# EasyEDA Pro project ProPrj_STM32_无人机_2026-08-31.epro, schematic 飞控

## Sheets
1 MCU: Assembly Variant: Basic; Board Name: Board1; Create Date: 2026-08-19; Page Name: P1; Project Name: STM32_无人机; Schematic Name: Schematic1; Update Date: 2026-08-19; Company: 嘉立创EDA; Page Size: A4; Version: V1.0
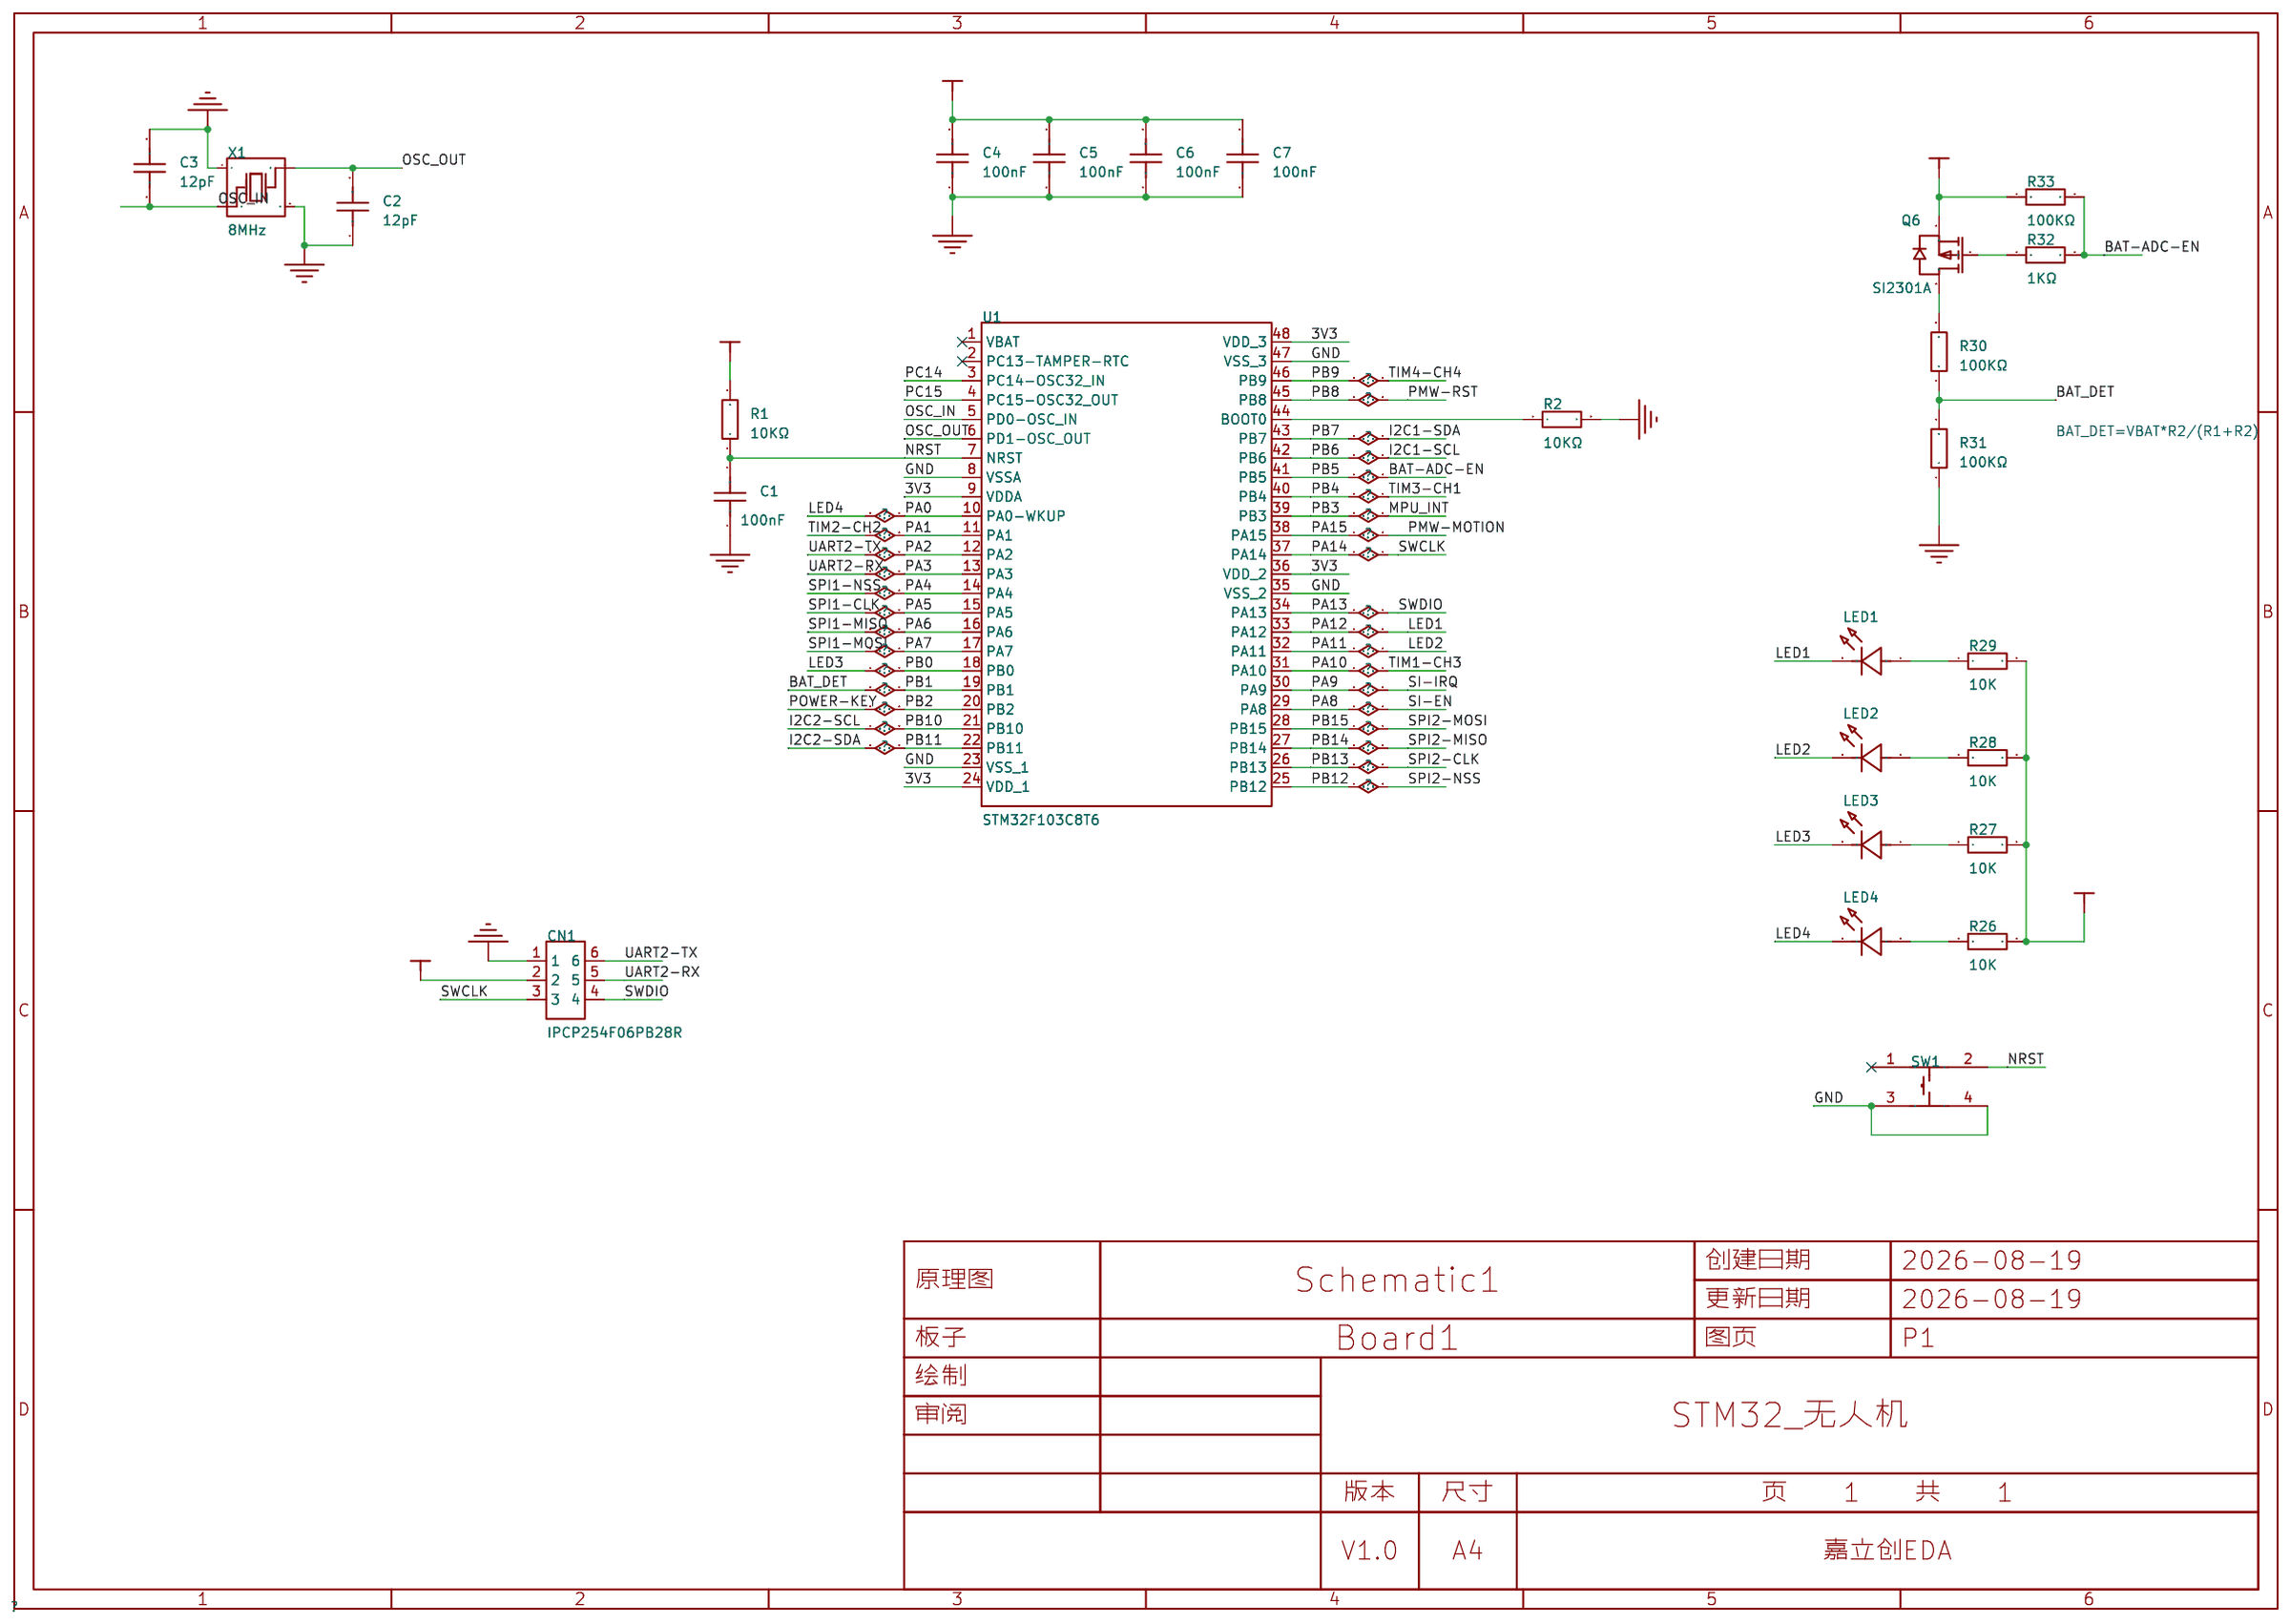
[diagram p5: MCU]
2 MPU6050
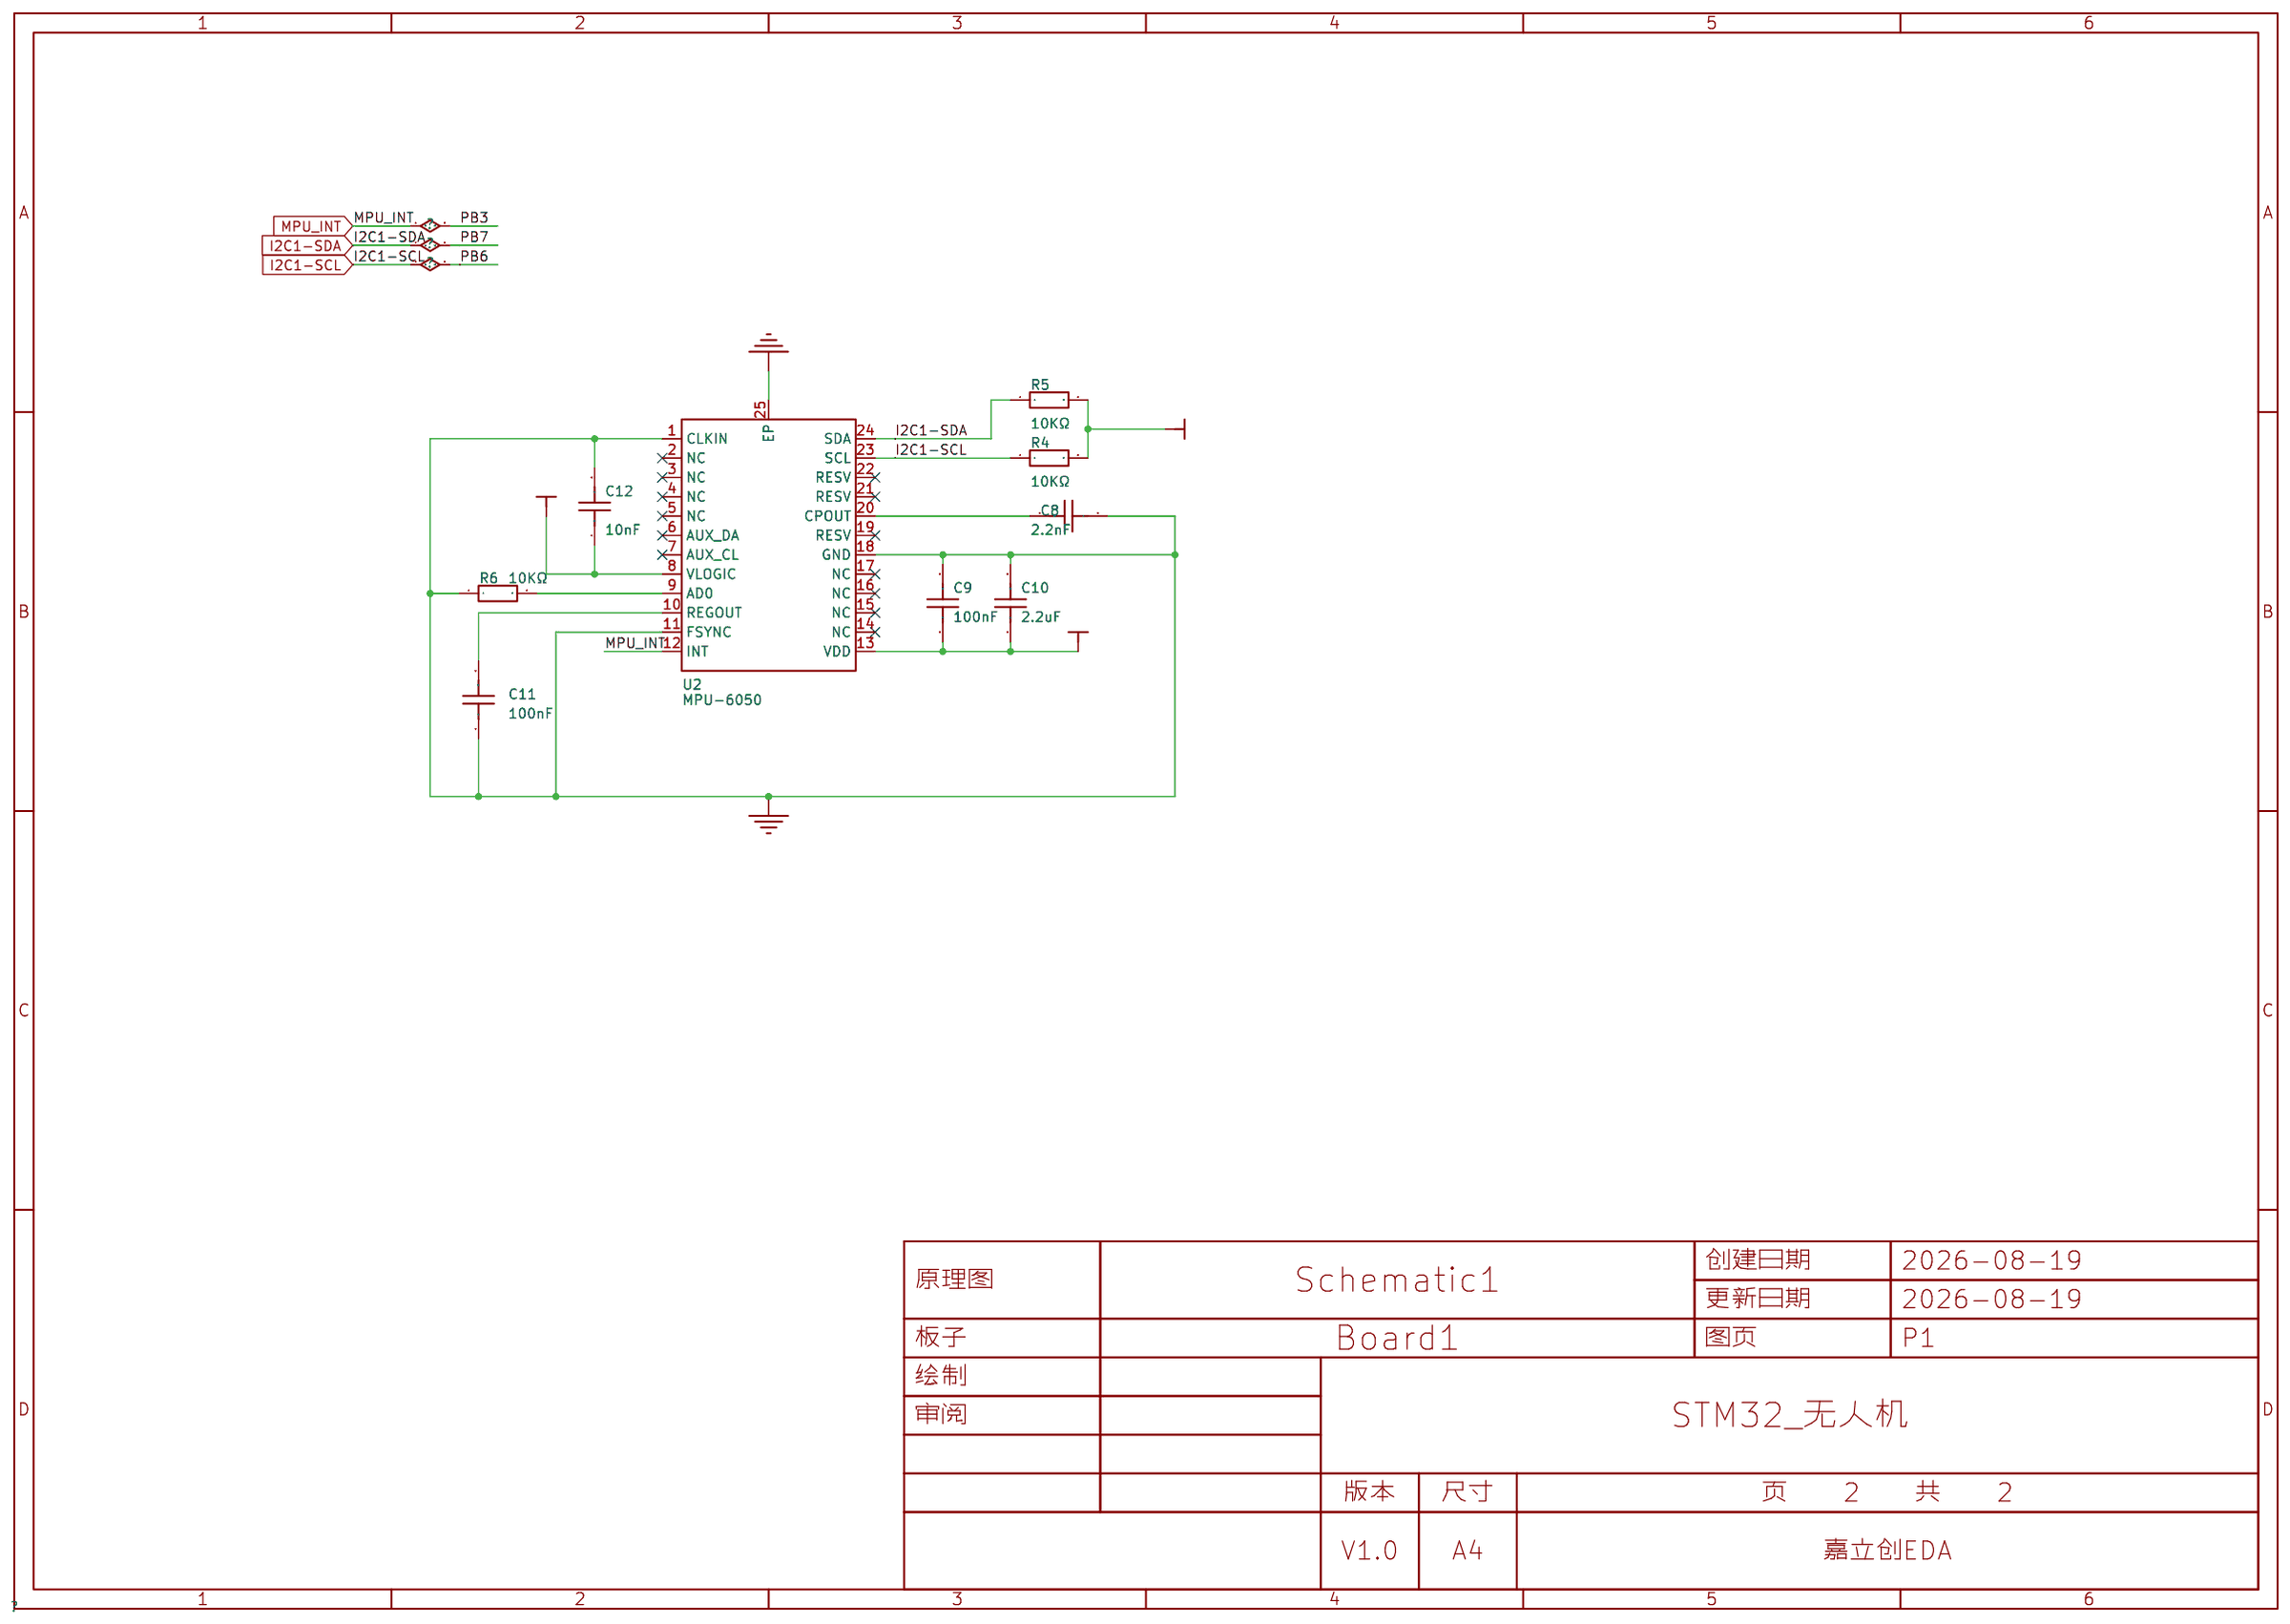
[diagram p6: MPU6050]
3 SI24R1
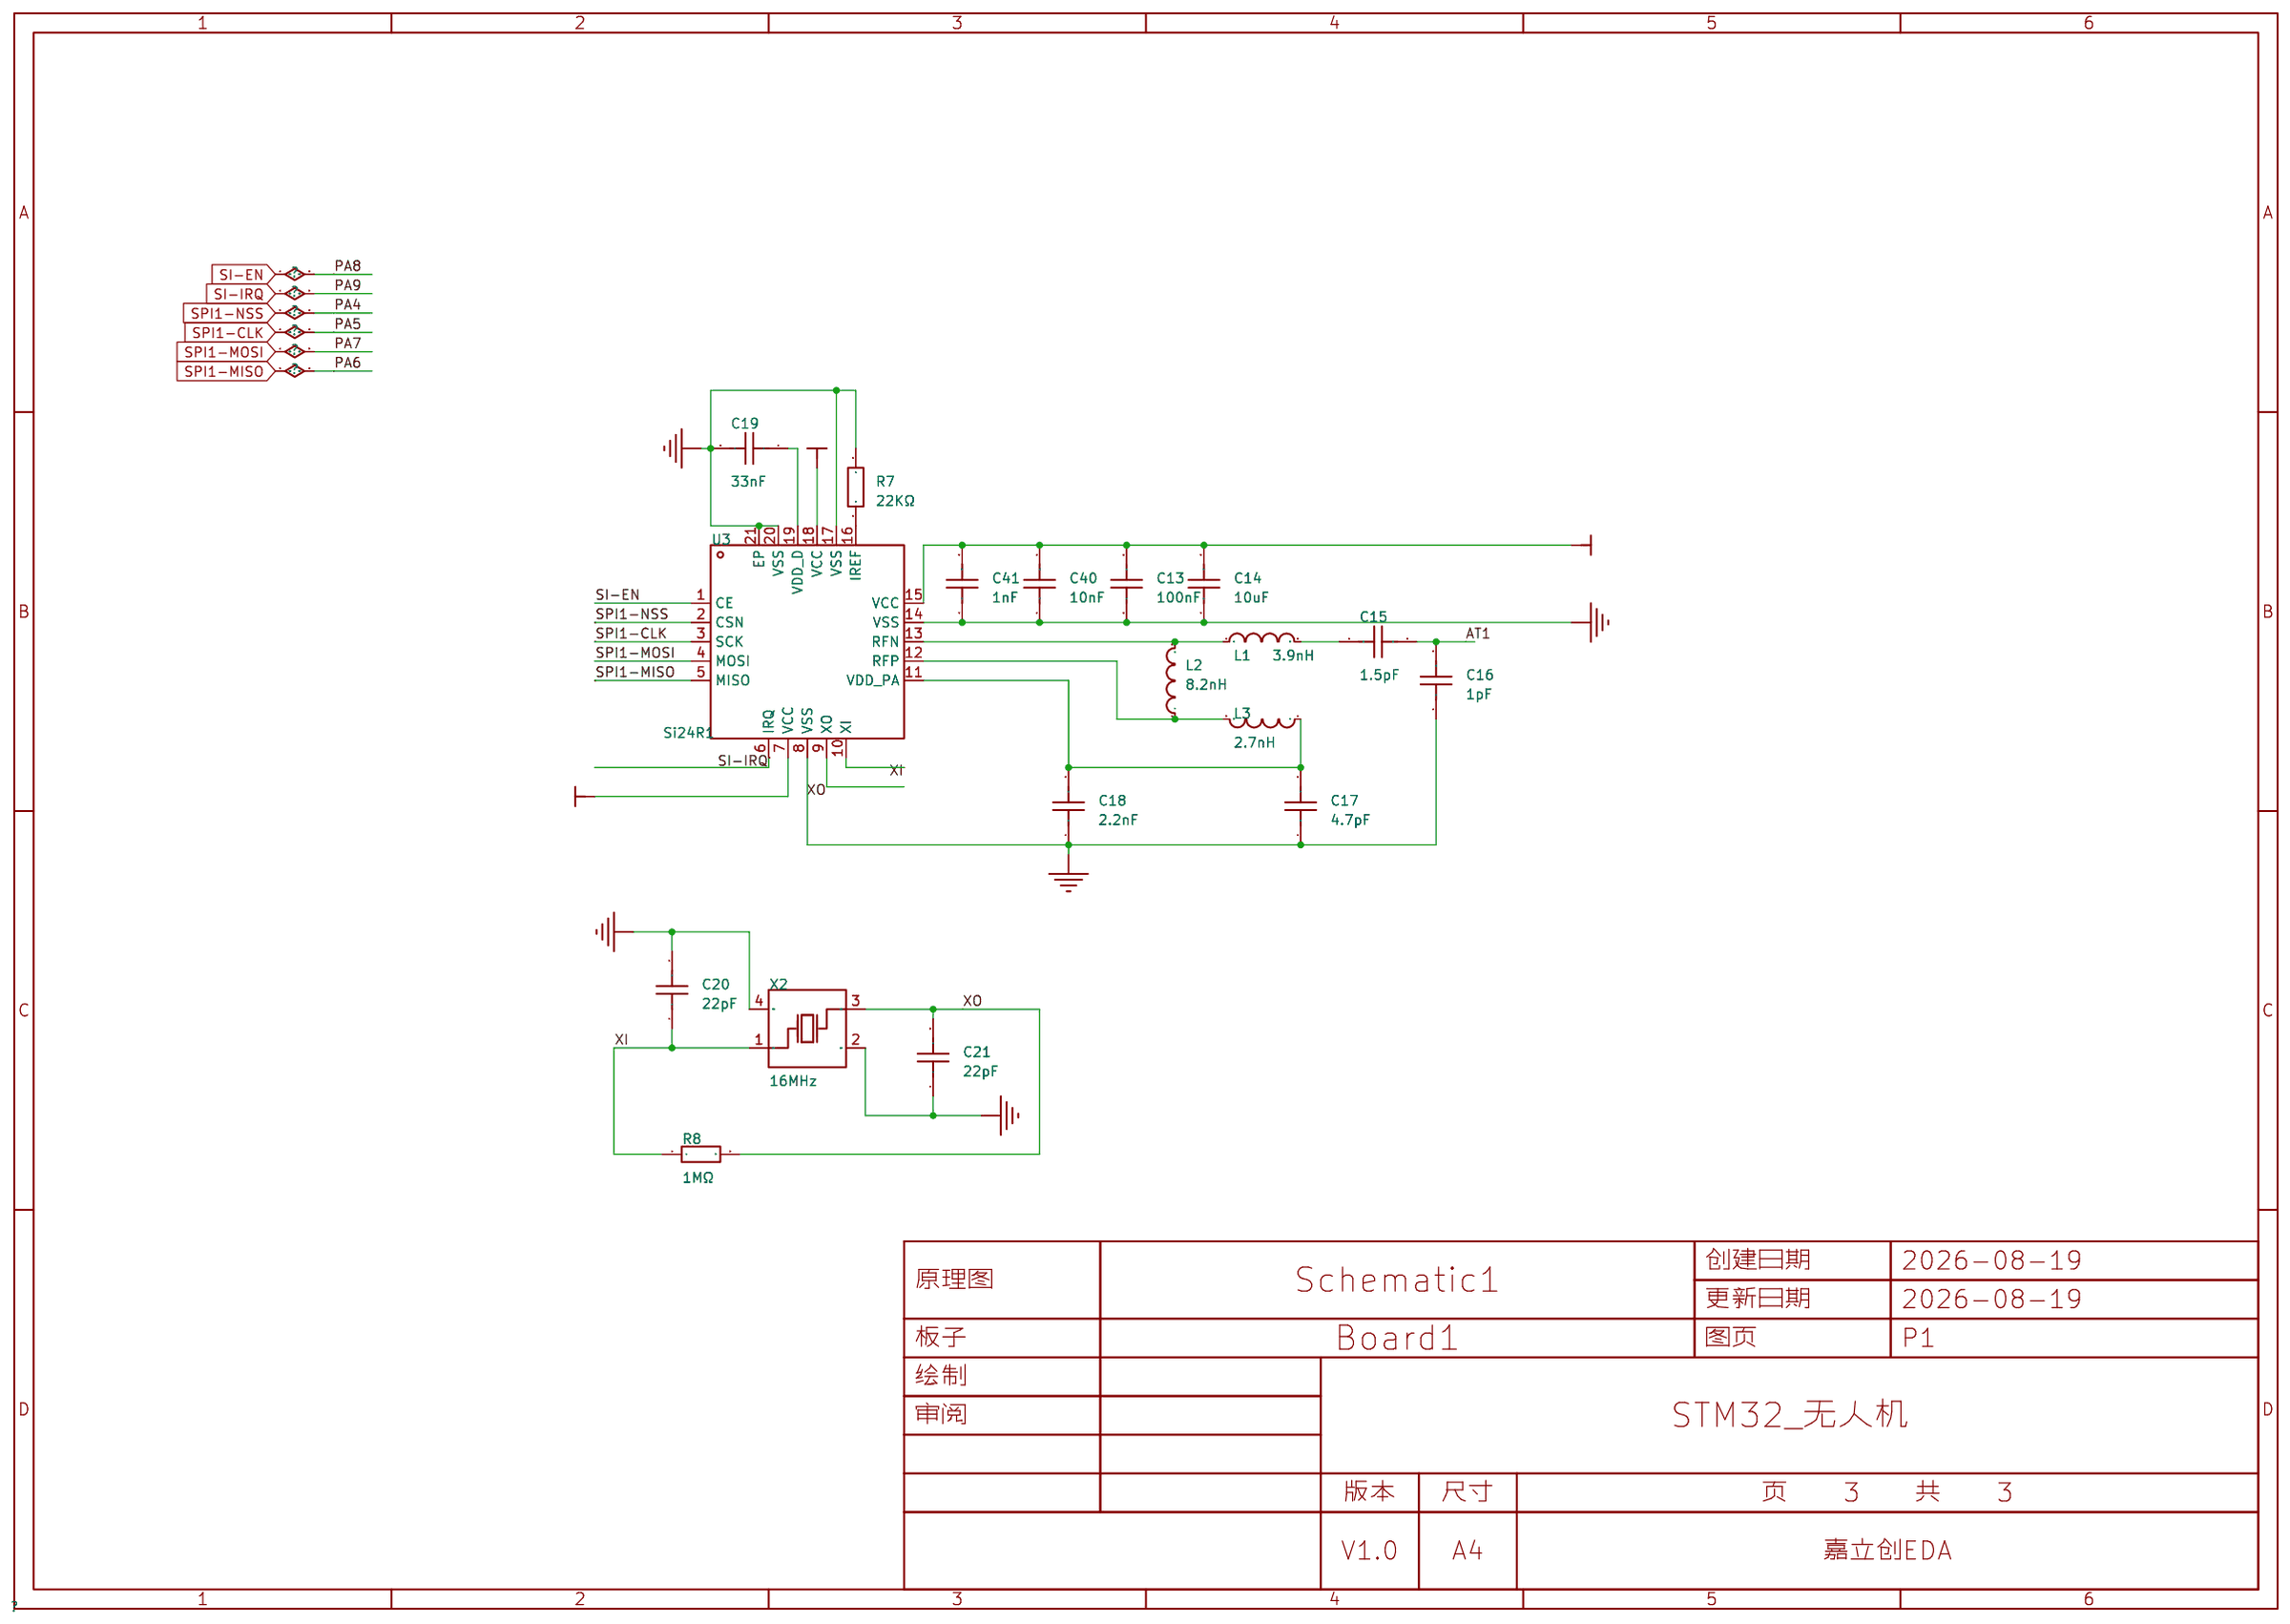
[diagram p7: SI24R1]
4 激光测高VL53
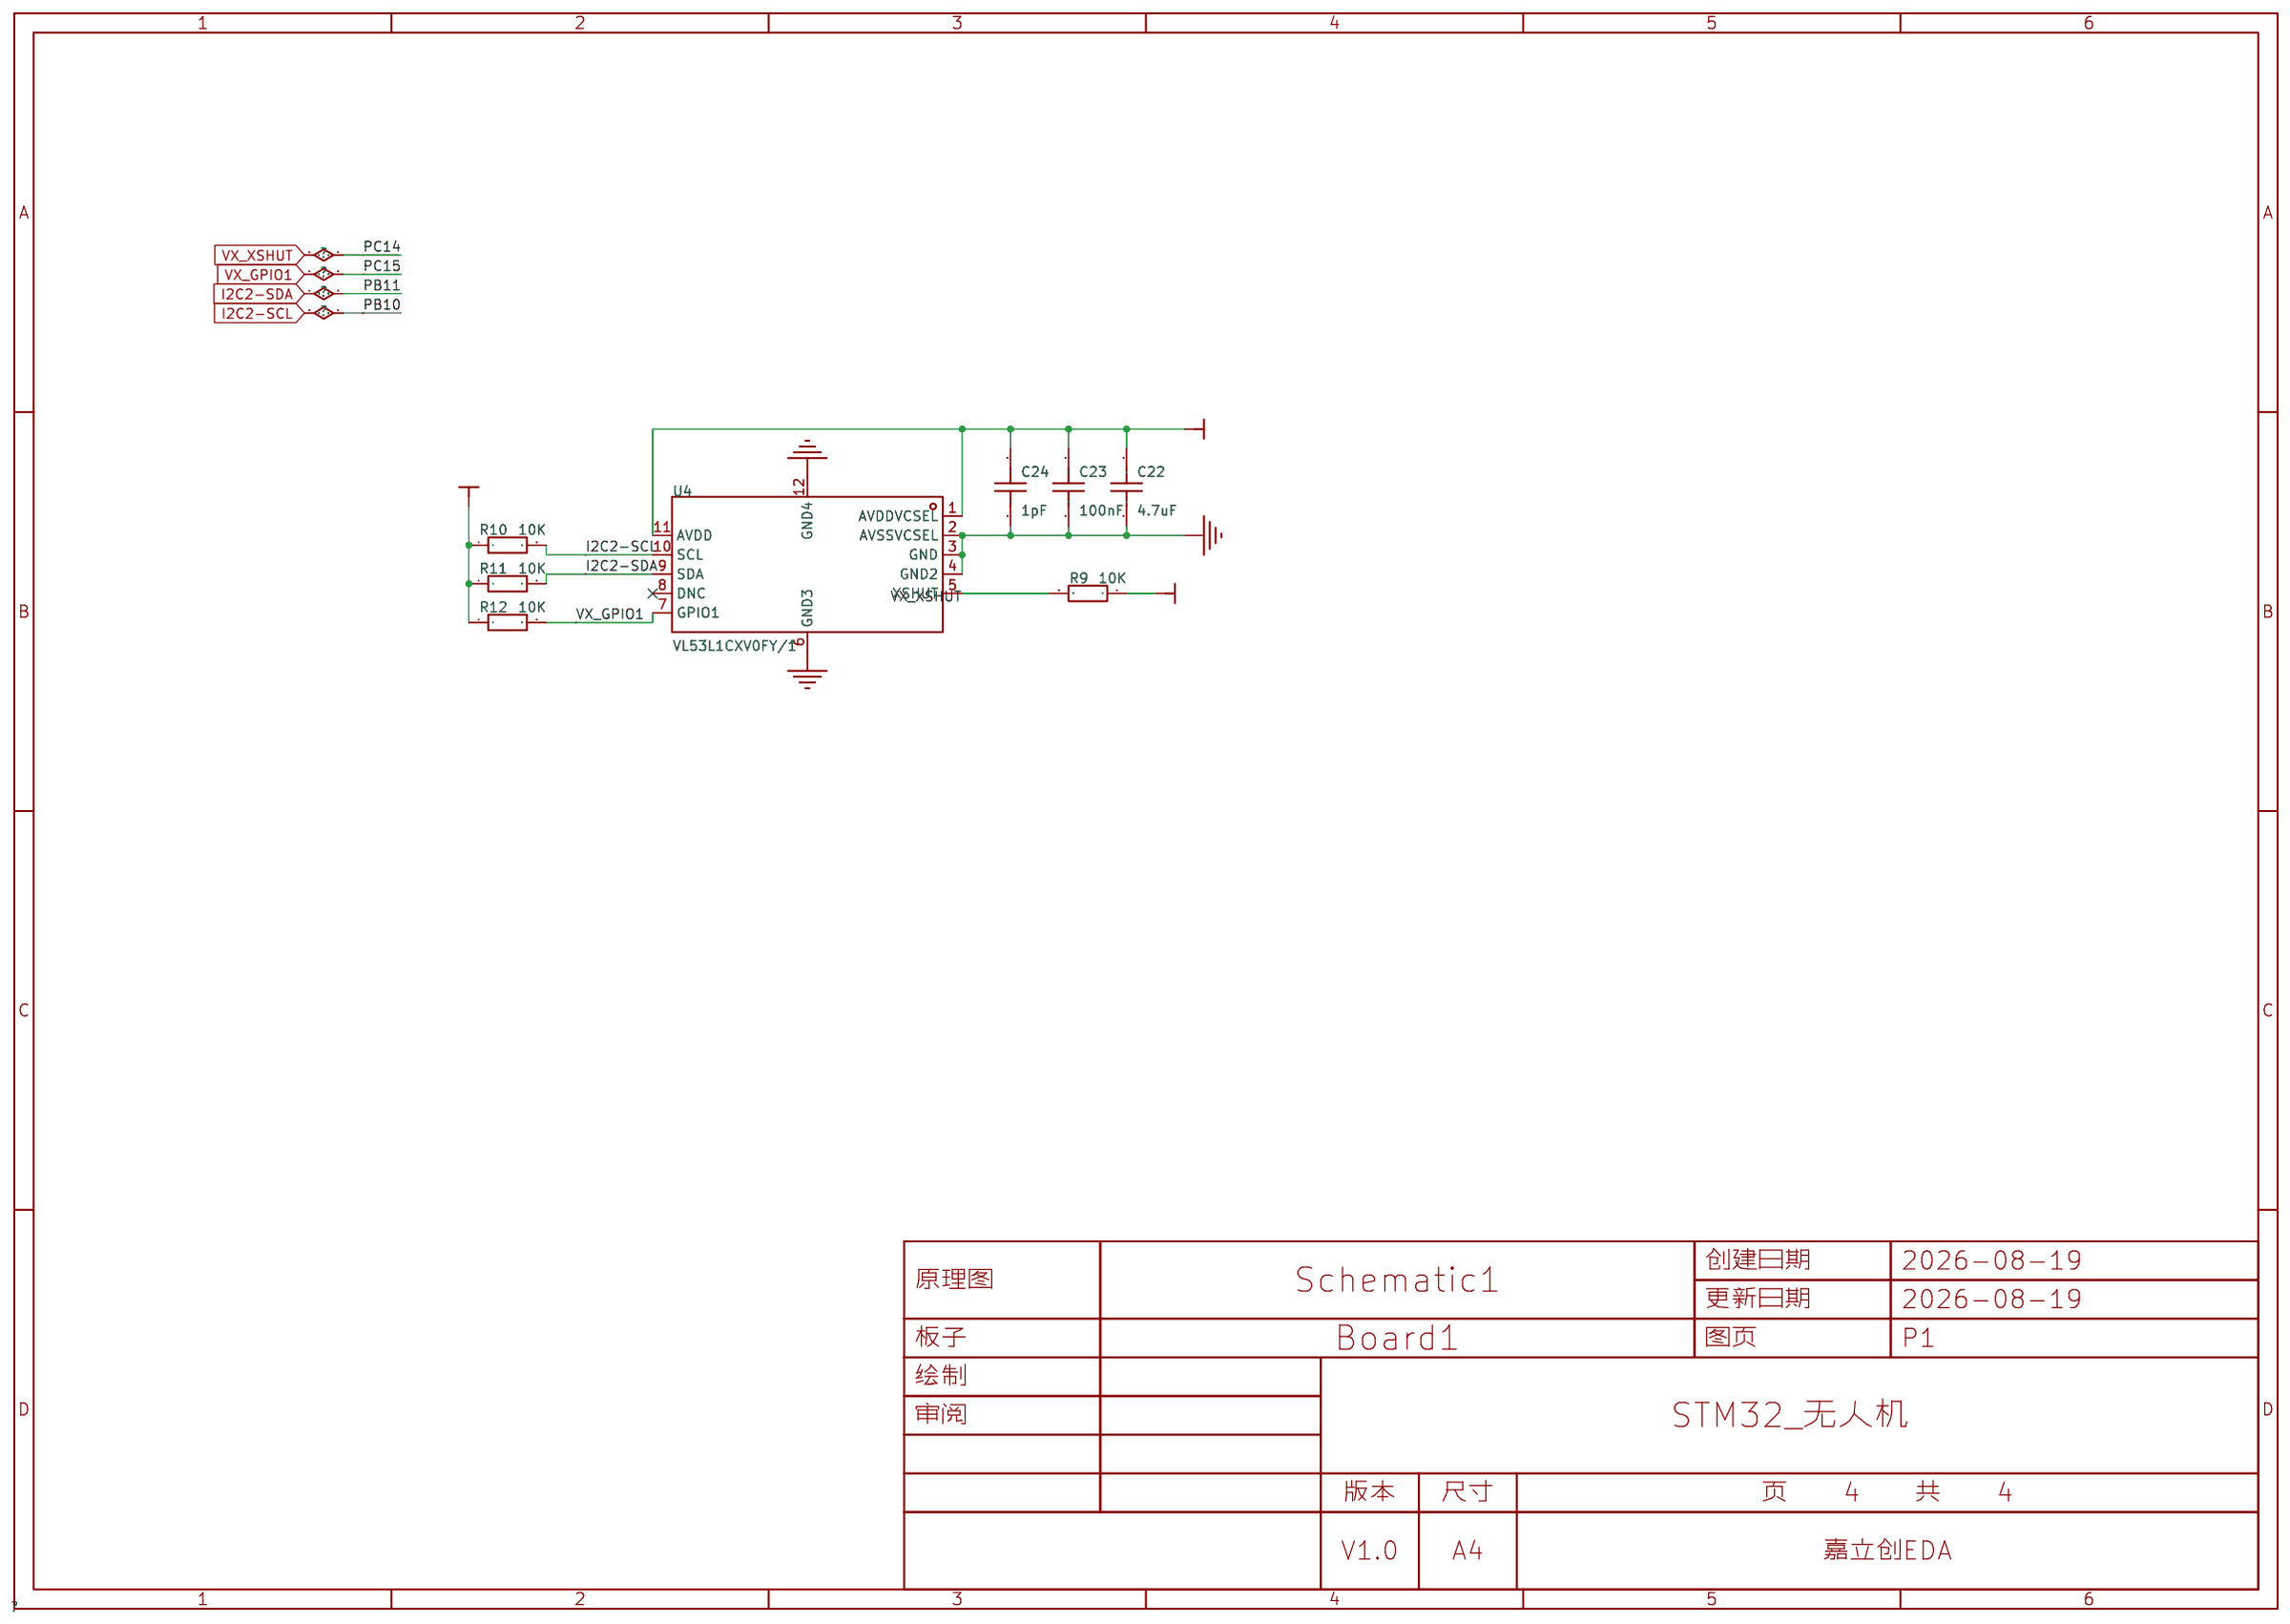
[diagram p8: 激光测高VL53]
5 电源管理
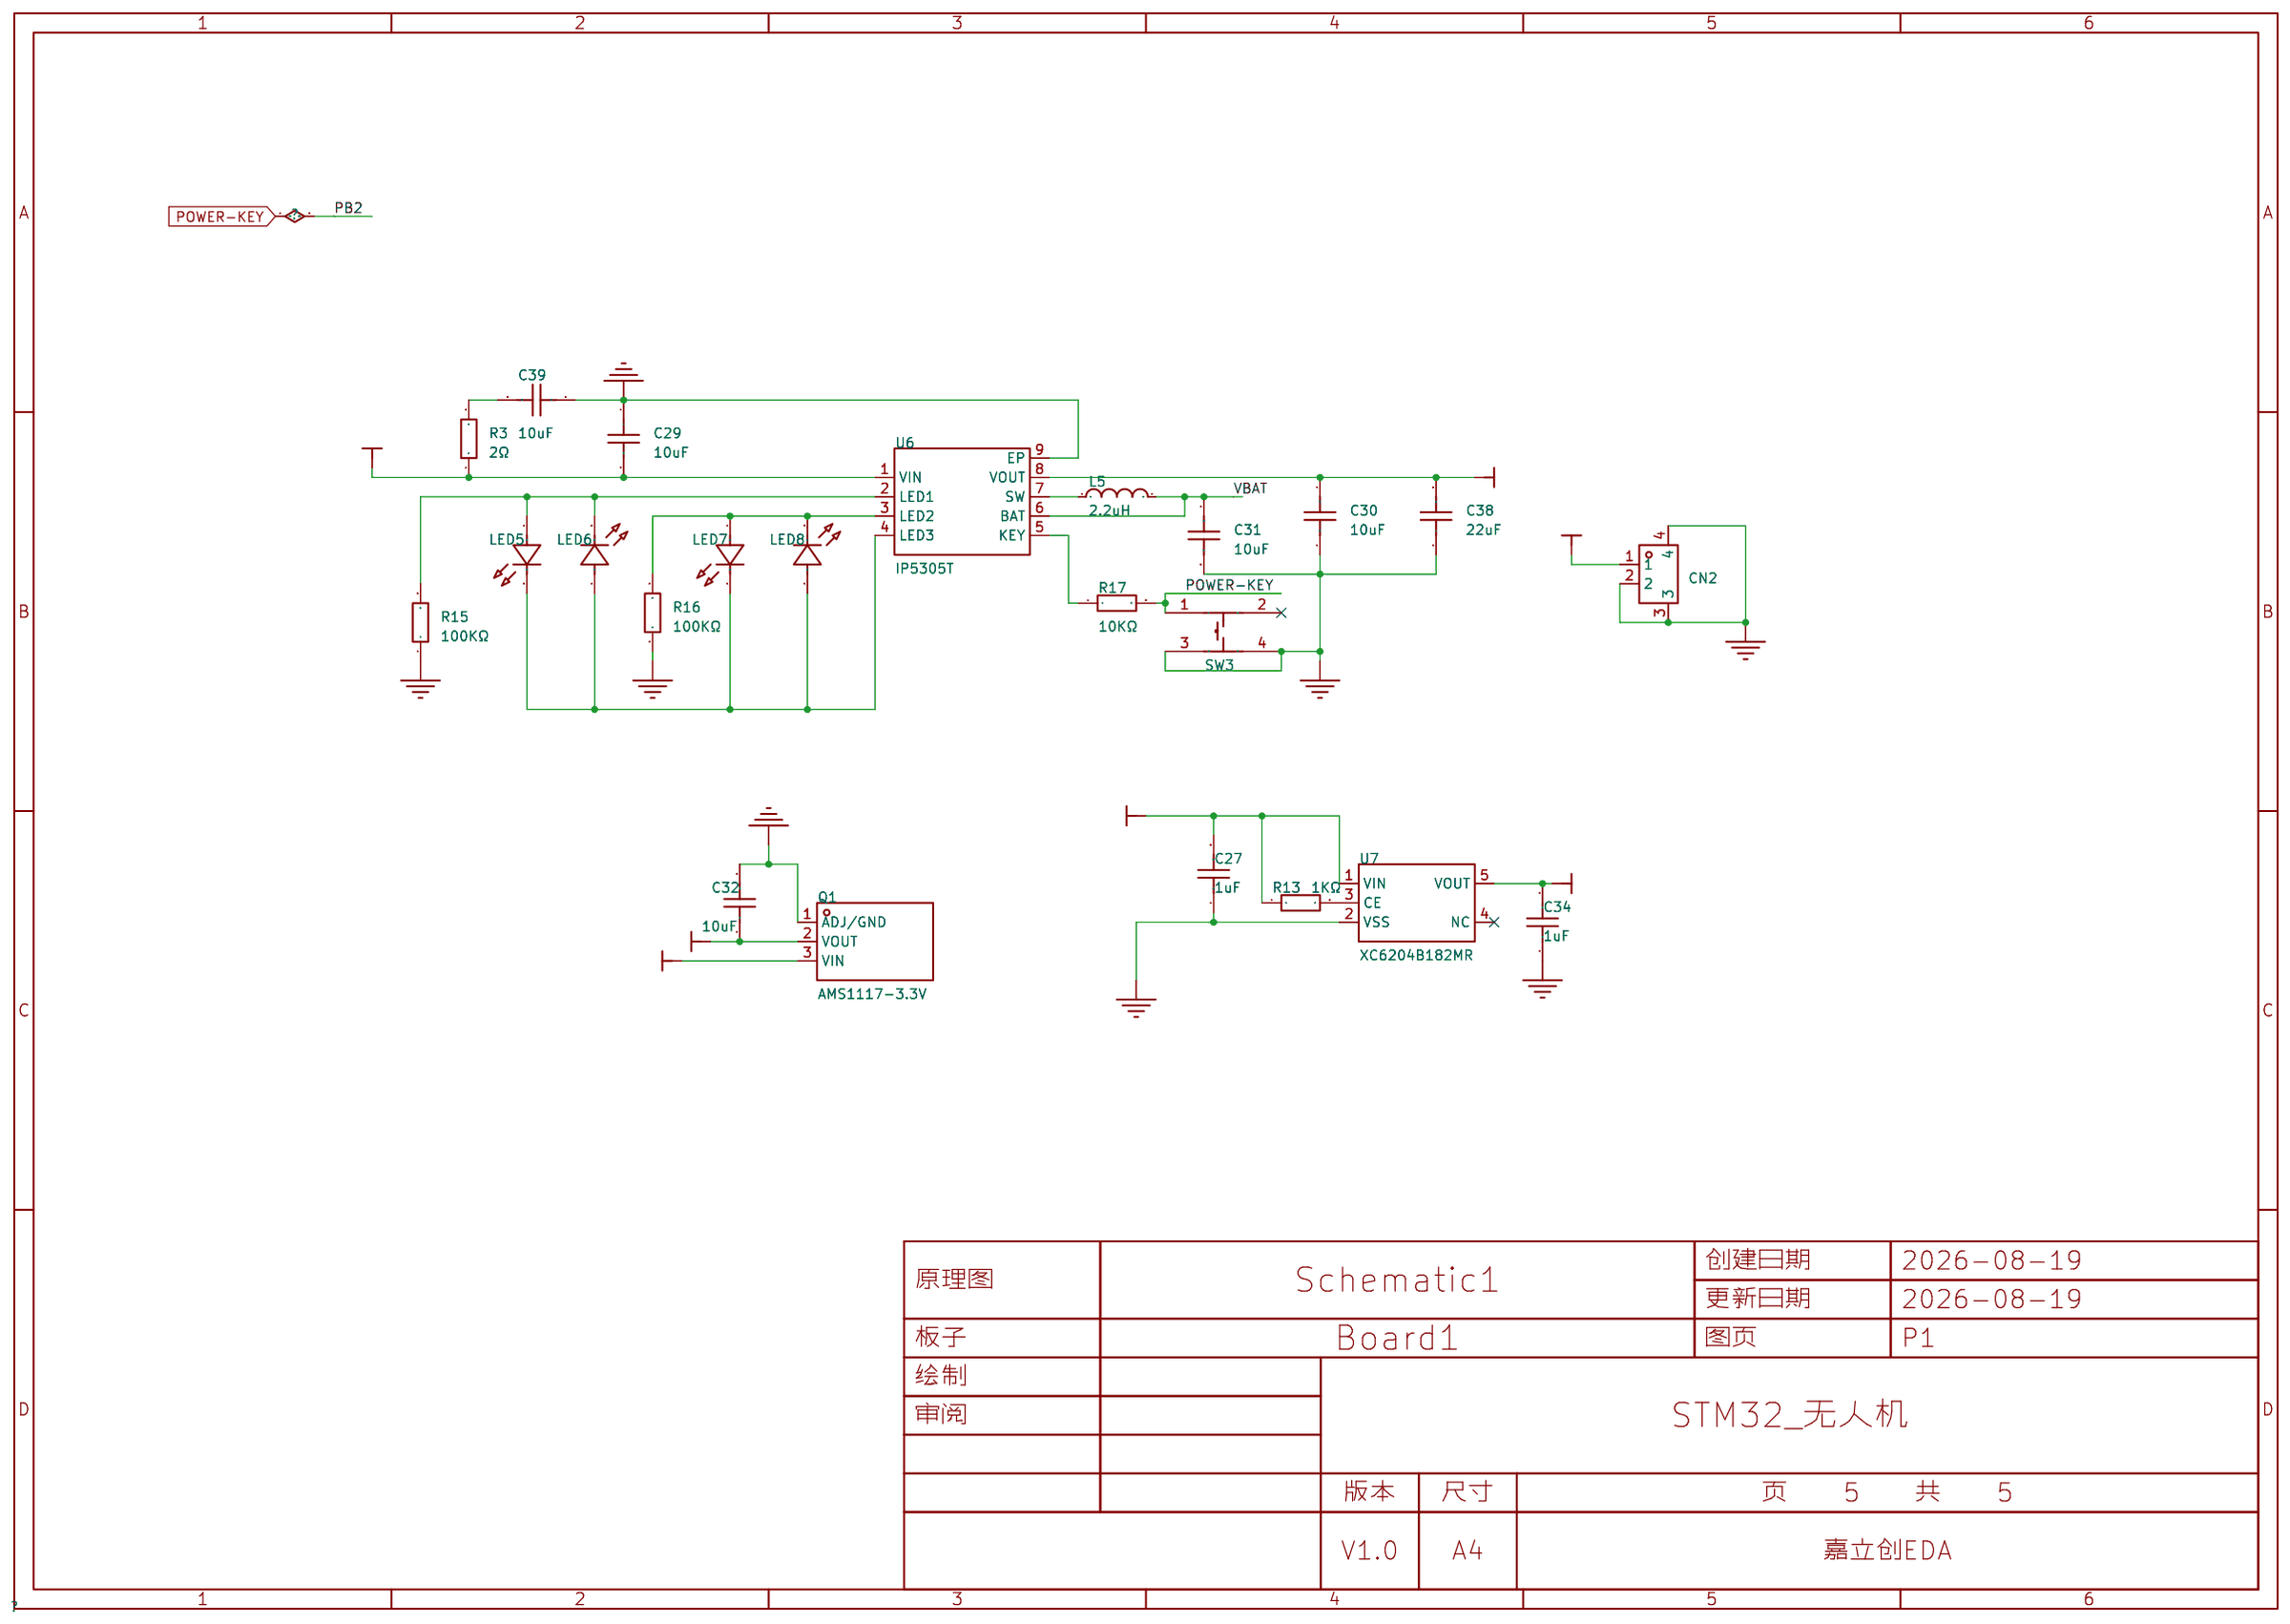
[diagram p9: 电源管理]
6 电机驱动: Create Date: 2026-08-20; Update Date: 2026-08-20
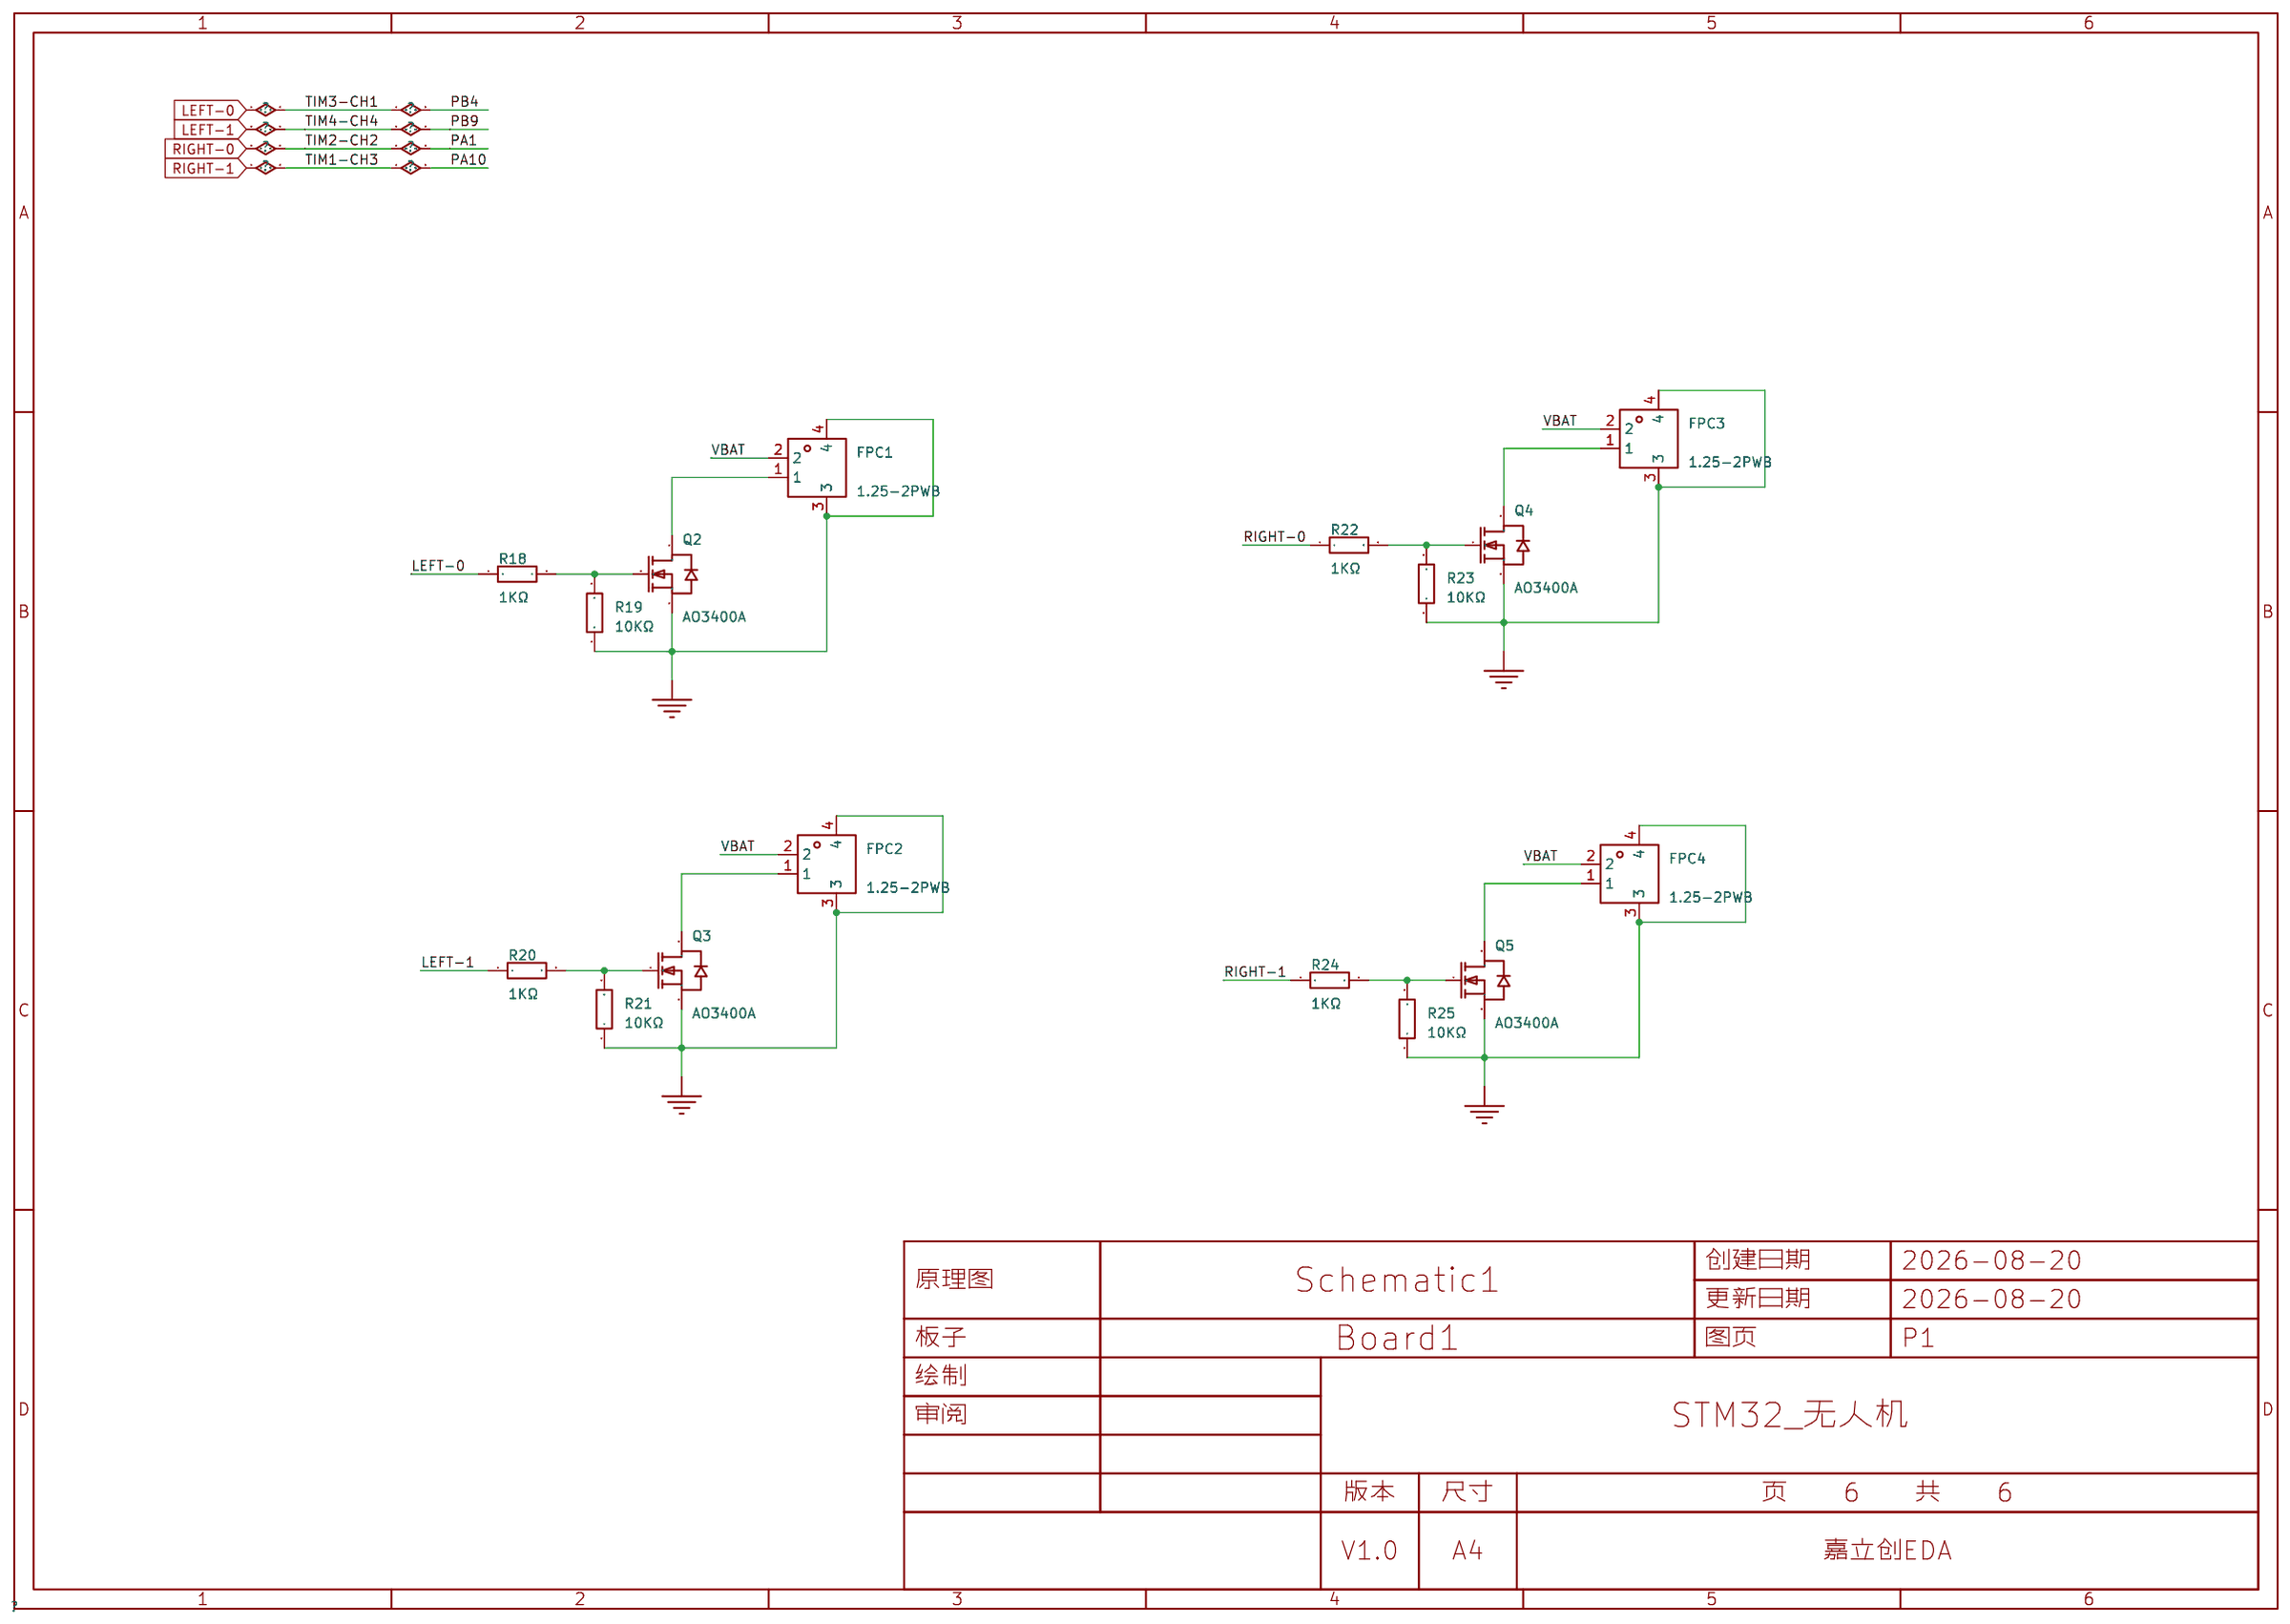
[diagram p10: 电机驱动]
7 光流PMW3901: Create Date: 2026-08-22; Schematic Name: 飞控板; Update Date: 2026-08-22
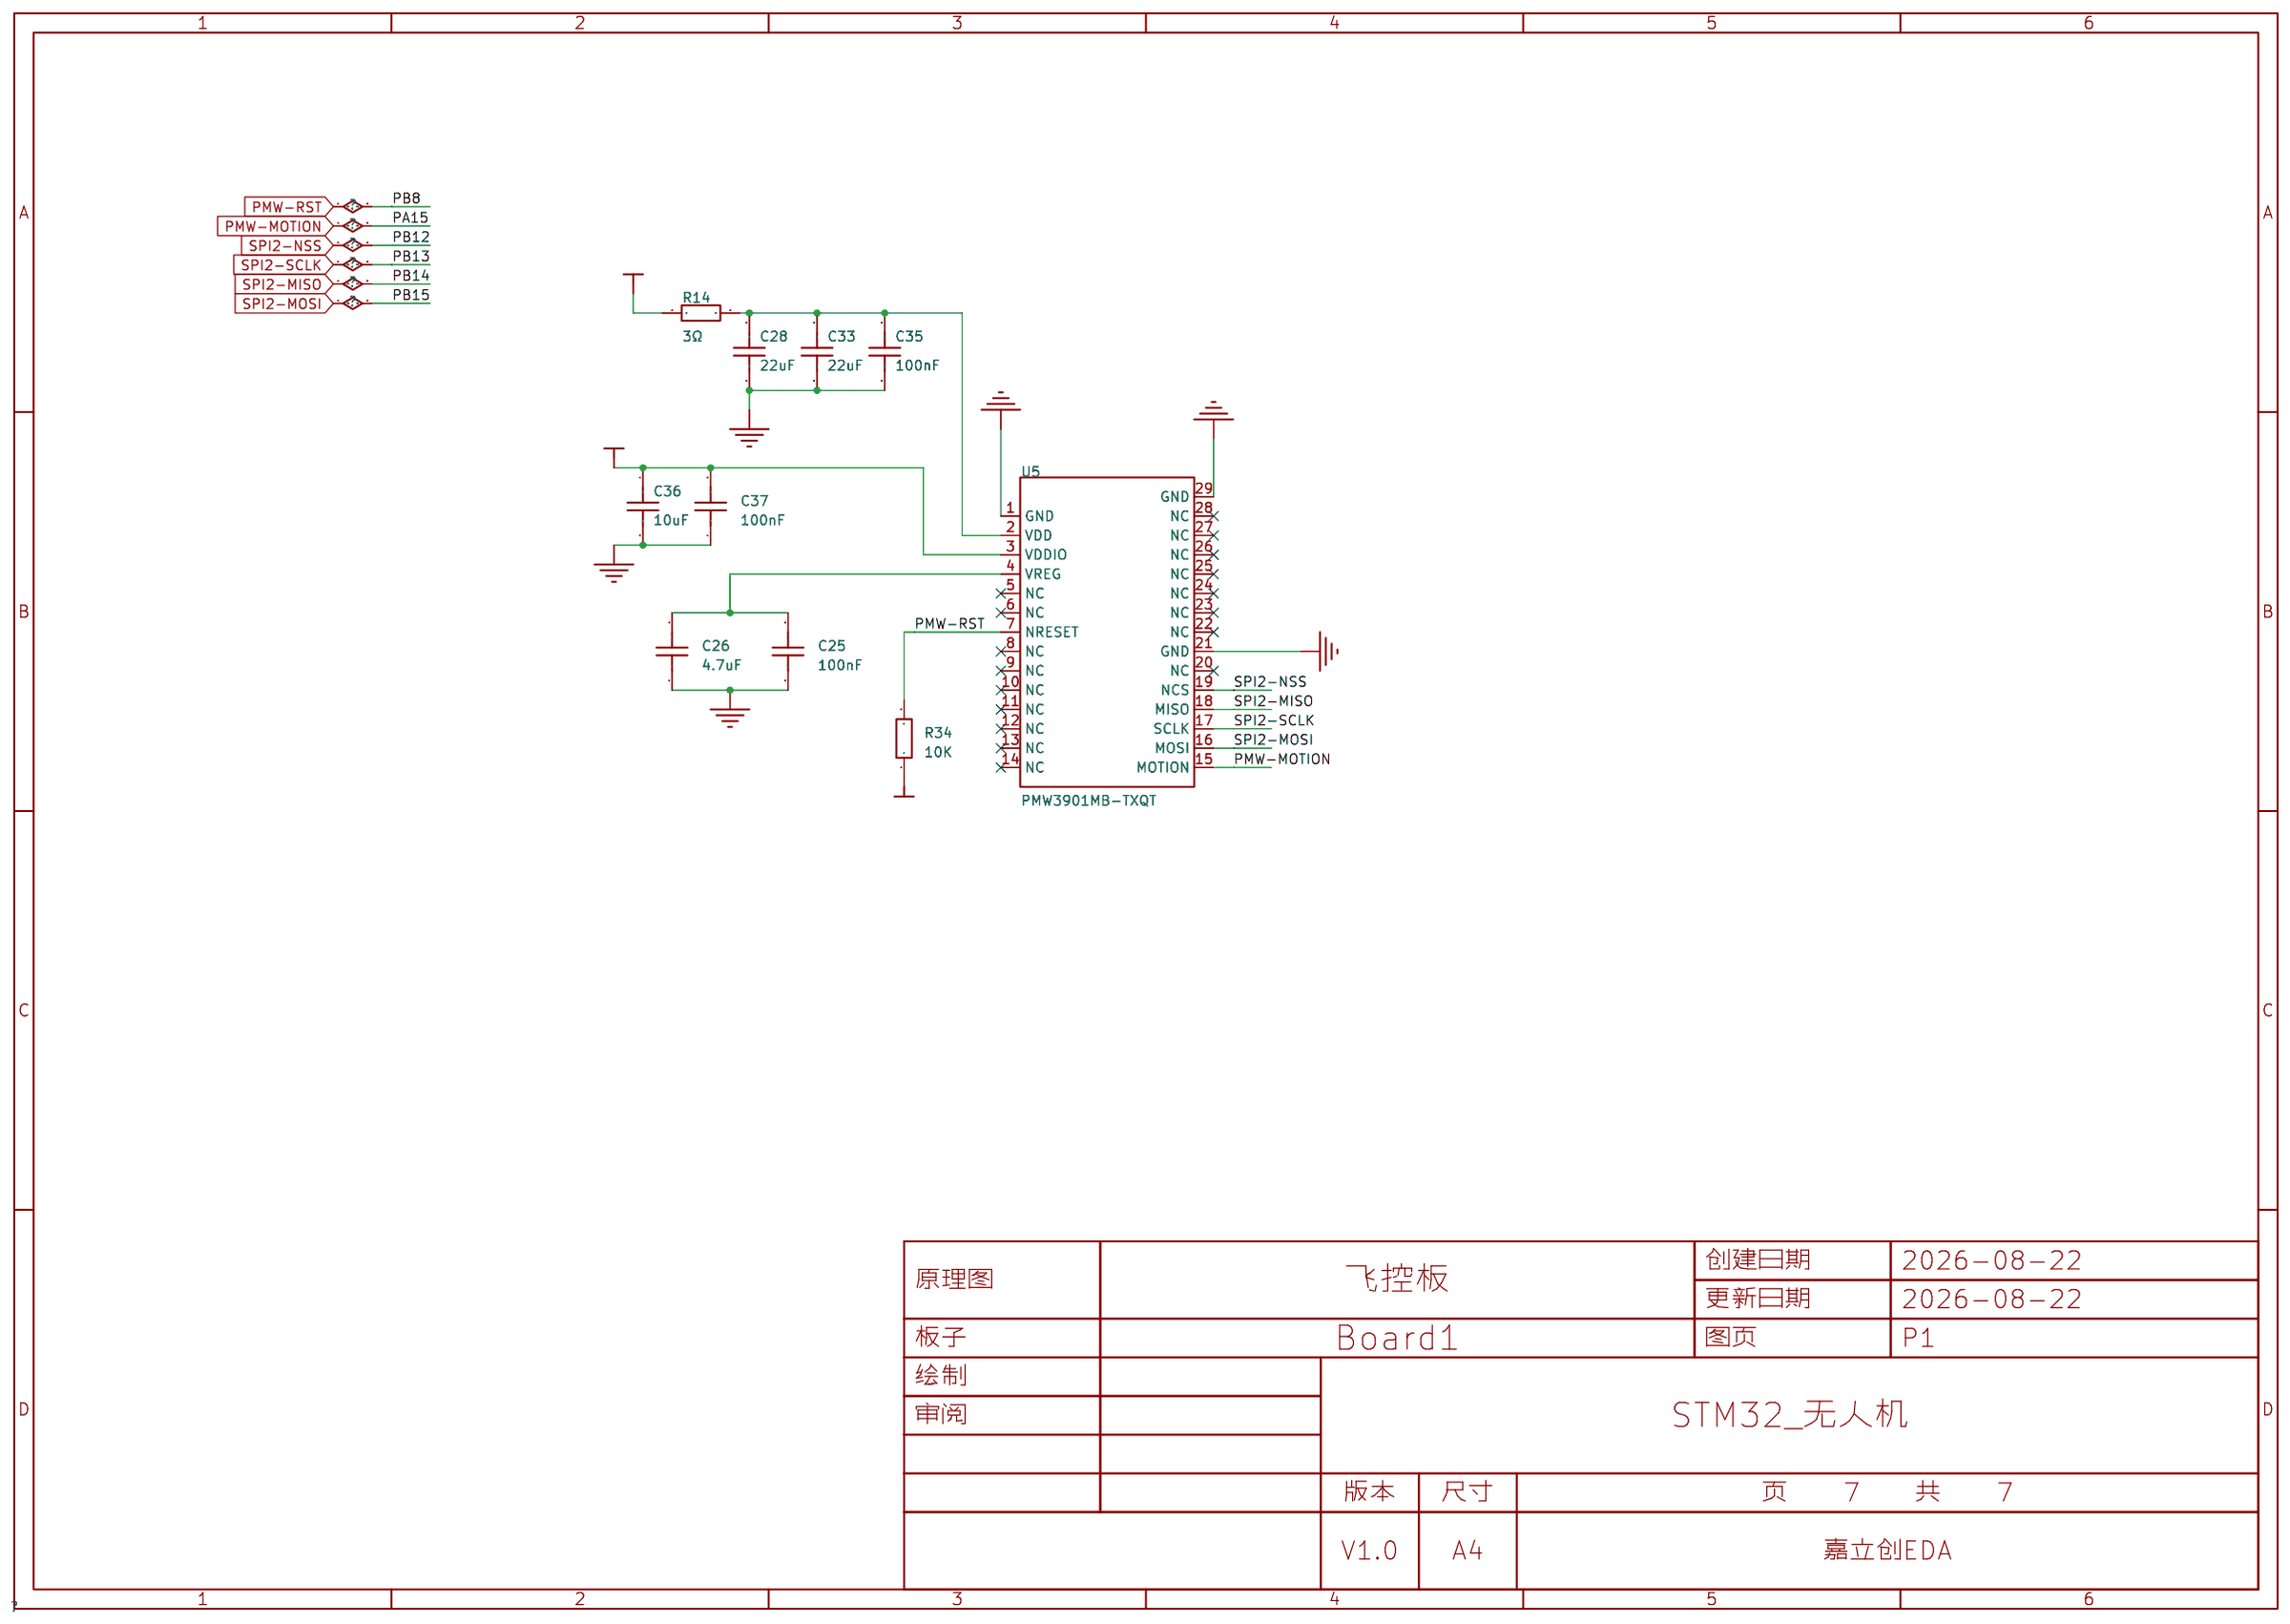
[diagram p11: 光流PMW3901]

## Parts
sheet MCU
C1  100nF  [C0603]
C2  12pF  [C0603]
C3  12pF  [C0603]
C4  100nF  [C0603]
C5  100nF  [C0603]
C6  100nF  [C0603]
C7  100nF  [C0603]
CN1  IPCP254F06PB28R  [HDR-TH_6P-P2.54-H-F-R2-C3-S2.54-1]
LED1  XL-1005UYC  [LED0402-FD_YELLOW]
LED2  XL-1005UYC  [LED0402-FD_YELLOW]
LED3  XL-1005UYC  [LED0402-FD_YELLOW]
LED4  XL-1005UYC  [LED0402-FD_YELLOW]
Q6  SI2301A  [SOT-23-3_L2.9-W1.3-P1.90-LS2.4-BR]
R1  10KΩ  [R0603]
R2  10KΩ  [R0603]
R26  10K  [R0603]
R27  10K  [R0603]
R28  10K  [R0603]
R29  10K  [R0603]
R30  100KΩ  [R0603]
R31  100KΩ  [R0603]
R32  1KΩ  [R0603]
R33  100KΩ  [R0603]
SW1  SKRPACE010  [KEY-SMD_4P-L4.2-W3.2-P2.20-LS4.6]
U1  STM32F103C8T6  [LQFP-48_L7.0-W7.0-P0.50-LS9.0-BL]
X1  8MHz  [CRYSTAL-SMD_4P-L3.2-W2.5-BL]
sheet MPU6050
C8  2.2nF  [C0603]
C9  100nF  [C0603]
C10  2.2uF  [C0603]
C11  100nF  [C0603]
C12  10nF  [C0603]
R4  10KΩ  [R0603]
R5  10KΩ  [R0603]
R6  10KΩ  [R0603]
U2  MPU-6050  [QFN-24_L4.0-W4.0-P0.50-BL-EP2.7]
sheet SI24R1
C13  100nF  [C0603]
C14  10uF  [C0603]
C15  1.5pF  [C0603]
C16  1pF  [C0603]
C17  4.7pF  [C0603]
C18  2.2nF  [C0603]
C19  33nF  [C0603]
C20  22pF  [C0603]
C21  22pF  [C0603]
C40  10nF  [C0603]
C41  1nF  [C0603]
L1  3.9nH  [L0603]
L2  8.2nH  [L0603]
L3  2.7nH  [L0603]
R7  22KΩ  [R0603]
R8  1MΩ  [R0603]
U3  Si24R1  [QFN-20_L4.0-W4.0-P0.50-BL-EP]
X2  16MHz  [CRYSTAL-SMD_4P-L2.5-W2.0-BL-2]
sheet 光流PMW3901
C25  100nF  [C0603]
C26  4.7uF  [C0603]
C28  22uF  [C0603]
C33  22uF  [C0603]
C35  100nF  [C0603]
C36  10uF  [C0603]
C37  100nF  [C0603]
R14  3Ω  [R0603]
R34  10K  [R0603]
U5  PMW3901MB-TXQT  [COB-28_L6.0-W6.0-P0.65-TL-EP]
sheet 激光测高VL53
C22  4.7uF  [C0603]
C23  100nF  [C0603]
C24  1pF  [C0603]
R9  10K  [R0603]
R10  10K  [R0603]
R11  10K  [R0603]
R12  10K  [R0603]
U4  VL53L1CXV0FY/1  [OPTO-SMD_VL53L1CXV0FY-1]
sheet 电机驱动
FPC1  1.25-2PWB  [CONN-SMD_2P-P1.25_DEALON_1.25-2PWB]
FPC2  1.25-2PWB  [CONN-SMD_2P-P1.25_DEALON_1.25-2PWB]
FPC3  1.25-2PWB  [CONN-SMD_2P-P1.25_DEALON_1.25-2PWB]
FPC4  1.25-2PWB  [CONN-SMD_2P-P1.25_DEALON_1.25-2PWB]
Q2  AO3400A  [SOT-23-3_L2.9-W1.3-P1.90-LS2.4-BR]
Q3  AO3400A  [SOT-23-3_L2.9-W1.3-P1.90-LS2.4-BR]
Q4  AO3400A  [SOT-23-3_L2.9-W1.3-P1.90-LS2.4-BR]
Q5  AO3400A  [SOT-23-3_L2.9-W1.3-P1.90-LS2.4-BR]
R18  1KΩ  [R0603]
R19  10KΩ  [R0603]
R20  1KΩ  [R0603]
R21  10KΩ  [R0603]
R22  1KΩ  [R0603]
R23  10KΩ  [R0603]
R24  1KΩ  [R0603]
R25  10KΩ  [R0603]
sheet 电源管理
C27  1uF  [C0603]
C29  10uF  [C0603]
C30  10uF  [C0603]
C31  10uF  [C0603]
C32  10uF  [C0603]
C34  1uF  [C0603]
C38  22uF  [C0603]
C39  10uF  [C0603]
CN2  ZX-XH2.54-2PWT  [CONN-SMD_2P-P2.54_MEGASTAR_ZX-XH2.54-2PWT]
L5  2.2uH  [IND-SMD_L2.5-W2.0_MHCHL2520]
LED5  XL-1005UYC  [LED0402-FD_YELLOW]
LED6  XL-1005UYC  [LED0402-FD_YELLOW]
LED7  XL-1005UYC  [LED0402-FD_YELLOW]
LED8  XL-1005UYC  [LED0402-FD_YELLOW]
Q1  AMS1117-3.3V  [SOT-89-3_L4.5-W2.5-P1.50-LS4.2-BR]
R3  2Ω  [R0603]
R13  1KΩ  [R0603]
R15  100KΩ  [R0603]
R16  100KΩ  [R0603]
R17  10KΩ  [R0603]
SW3  SKRPACE010  [KEY-SMD_4P-L4.2-W3.2-P2.20-LS4.6]
U6  IP5305T  [ESOP-8_L4.9-W3.9-P1.27-LS6.0-BL-EP]
U7  XC6204B182MR  [SOT-23-5_L3.0-W1.5-P0.95-LS2.8-BL]

## Library data of the parts
C1-C41 = CAP_0603: Supplier Footprint: 0603
CN1 = IPCP254F06PB28R: 插孔结构:2x3P;间距:2.54mm;圆孔/方孔:方孔;安装方式:弯插;排数:双排;总孔位数:6P;额定电流:3A;额定电压:-;塑高:5mm;触头材质:黄铜;触头镀层:金;工作温度:-40℃~+105℃;; LCSC Part Name: 2x3P 间距:2.54mm 弯插; Supplier Part: C22438452; Manufacturer: INCP; Supplier Footprint: 弯插,P=2.54mm; JLCPCB Part Class: Extended Part; Datasheet: https://item.szlcsc.com/datasheet/IPCP254F06PB28R/24076641.html; Supplier: LCSC; Holes Structure: 2x3P; Pitch: 2.54mm; Circular Hole / Square Hole: 方孔; Mounting Type: 弯插; Number of Rows: 双排; Number of Positions: 6P; Current Rating: 3A; Insulation Height: 5mm; Contact Material: 黄铜; Contact Plating: 金; Operating Temperature: -40℃~+105℃
LED1-LED8 = XL-1005UYC_C25503856: 灯头类型:1.0mmx0.5mm方形灯头;发光颜色:黄色;正向压降(Vf):2.4V;功率:50mW;正向电流:20mA;波长:585nm~595nm;二极管配置:独立二极管;透镜颜色:无色透明透镜;色温:-;发光强度:210mcd;发光角度:120°;载带方式:-;工作温度:-40℃~+85℃;; LCSC Part Name: 0402黄光贴片式发光二极管; Supplier Part: C25503856; Manufacturer: XINGLIGHT(成兴光); Supplier Footprint: 0402; JLCPCB Part Class: Extended Part; Datasheet: https://item.szlcsc.com/datasheet/XL-1005UYC/27234970.html; Supplier: LCSC; Lamp Holder Type: 1.0mmx0.5mm方形灯头; Illumination Color: 黄色; Voltage - Forward(Vf): 2.4V; Power(Watts): 50mW; Forward Current: 20mA; Wavelength - Dominant: 585nm~595nm; Peak Wavelength: 590nm; Diode Configuration: 独立二极管; Lens Color: 无色透明透镜; Luminous Intensity: 210mcd; Viewing Angle: 120°; Operating Temperature: -40℃~+85℃
Q6 = SI2301A: 数量:1个P沟道;漏源电压(Vdss):20V;连续漏极电流(Id):2.8A;导通电阻(RDS(on)):90mΩ@4.5V；110mΩ@2.5V;耗散功率(Pd):400mW;阈值电压(Vgs(th)):1V@250uA;; LCSC Part Name: 1个P沟道 耐压:20V 电流:2.8A; Supplier Part: C347482; Manufacturer: UMW(友台半导体); Supplier Footprint: SOT-23; JLCPCB Part Class: Extended Part; Datasheet: https://item.szlcsc.com/datasheet/SI2301A/324142.html; Supplier: LCSC; Number: 1个P沟道; Drain to Source Voltage: 20V; Current - Continuous Drain(Id): 2.8A; RDS(on): 90mΩ@4.5V；110mΩ@2.5V; Pd - Power Dissipation: 400mW; Gate Threshold Voltage (Vgs(th)): 1V@250uA; Gate Charge(Qg): 5.5nC@4.5V；3.3nC@2.5V; Input Capacitance(Ciss): 405pF; Reverse Transfer Capacitance (Crss@Vds): 55pF; Operating Temperature: -55℃~+150℃; Type: P沟道; Output Capacitance(Coss): 75pF
R1-R34 = Res_0603: Supplier Footprint: 0603
SW1 SW3 = SKRPACE010: 电路结构:单刀单掷;按钮形状:椭圆形按钮;安装方式:立贴;开关长度:4.2mm;开关宽度:3.2mm;开关高度:2.5mm;触点电流:50mA;额定电压:16V;带灯:-;工作寿命:-;; LCSC Part Name: 4.2*3.2*2.5mm 立贴 轻触开关; Supplier Part: C139797; Manufacturer: ALPSALPINE(阿尔卑斯阿尔派); Supplier Footprint: SMD-4P,4.2x3.2mm; JLCPCB Part Class: Extended Part; Datasheet: https://item.szlcsc.com/datasheet/SKRPACE010/151122.html; Supplier: LCSC; Circuit: 单刀单掷; Actuator Style: 椭圆形按钮; Mounting Type: 立贴; Length: 4.2mm; Width: 3.2mm; Switch Height: 2.5mm; Contact Current: 50mA; Voltage Rating: 16V
U1 = STM32F103C8T6: CPU内核:ARM Cortex-M3;CPU最大主频:72MHz;CPU位数:32 Bit;; LCSC Part Name: 主流增强型ARM Cortex-M3 MCU，具有64 KB Flash、72 MHz CPU、电机控制、USB和CAN; Supplier Part: C8734; Manufacturer: ST(意法半导体); Supplier Footprint: LQFP-48(7x7); JLCPCB Part Class: Extended Part; Datasheet: https://item.szlcsc.com/datasheet/STM32F103C8T6/9243.html; Supplier: LCSC; CPU Core: ARM Cortex-M3; CPU Maximum Speed: 72MHz; Core Size: 32 Bit; Program Storage Size: 64KB; Program Memory Type: FLASH; RAM Size: 20KB; Number of I/O: 37; ADC (Bit): 12bit; Oscillator Type: 内置; Voltage - Supply: 2V~3.6V; Operating Temperature: -40℃~+85℃
X1 = TAXM8M4RDBCCT2T: 晶振类型:贴片晶振;频率:8MHz;常温频差:±10ppm;负载电容:10pF;频率稳定度:±15ppm;; LCSC Part Name: 8MHz ±10ppm 10pF; Supplier Part: C400090; Manufacturer: YJX(雅晶鑫); Supplier Footprint: SMD3225-4P; JLCPCB Part Class: Extended Part; Datasheet: https://item.szlcsc.com/datasheet/TAXM8M4RDBCCT2T/383475.html; Supplier: LCSC; Type: 贴片晶振; Normal temperature Frequency Tolerance: ±10ppm; Load Capacitance: 10pF; Frequency Stability: ±15ppm; Equivalent Series Resistance(ESR): 250Ω; Operating Temperature: -40℃~+85℃
U2 = MPU-6050: 传感器类型:IMU(加速度计+陀螺仪);接口类型:I2C;; Supplier Part: C24112; Manufacturer: TDK InvenSense(应美盛); Supplier Footprint: QFN-24-EP(4x4); JLCPCB Part Class: Extended Part; Datasheet: https://item.szlcsc.com/datasheet/MPU-6050/24852.html; Supplier: LCSC; Accelerometer Sensing Axis: X,Y,Z; Acceleration Measurement Range (MAX): ±16g; Gyroscope Sensing Axis: X,Y,Z; Gyroscope Measurement Range (MAX): ±2000dps; Sensor Type: IMU(加速度计+陀螺仪); Output Bits: 16bit; Interface: I2C; Voltage - Supply: 2.375V~3.46V; Cache Size: 1KB; Standby Current: 5uA; Operating Temperature: -40℃~+85℃; Features: 运动事件检测；同步与时间戳
L1-L3 = L_0603
U3 = Si24R1: 频率范围:2.4GHz~2.525GHz;接口类型:SPI;应用领域:ISM;数据速率:2Mbps;灵敏度:-96dBm;典型应用频率:2.4GHz;; LCSC Part Name: 超低功耗、高性能2.4 GHz GFSK收发器; Supplier Part: C14436; Manufacturer: 南京中科微; Supplier Footprint: QFN-20-EP(4x4); JLCPCB Part Class: Extended Part; Datasheet: https://item.szlcsc.com/datasheet/Si24R1/15098.html; Supplier: LCSC; Frequency Range: 2.4GHz~2.525GHz; Interface: SPI; Voltage - Supply: 1.9V~3.6V; Applications: ISM; Output Power: 7dBm; Data Rate: 2Mbps; Current Of Transmitting: 12mA; Sensitivity: -96dBm; Receive Current: 15mA; Typical Application Frequency: 2.4GHz; Operating Temperature: -40℃~+85℃; Type: 收发器; Features: CRC校验功能；支持RSSI功能；自动重传功能；自动应答功能
X2 = SX25Y016000B91T: 晶振类型:贴片晶振;频率:16MHz;常温频差:±10ppm;负载电容:9pF;频率稳定度:±10ppm;; LCSC Part Name: 2520 16M 9PF  10ppm  -20 -75℃; Supplier Part: C271644; Manufacturer: TKD(泰晶); Supplier Footprint: SMD2520-4P; JLCPCB Part Class: Extended Part; Datasheet: https://item.szlcsc.com/datasheet/SX25Y016000B91T/260707.html; Supplier: LCSC; Type: 贴片晶振; Normal temperature Frequency Tolerance: ±10ppm; Load Capacitance: 9pF; Frequency Stability: ±10ppm; Equivalent Series Resistance(ESR): 80Ω
U5 = PMW3901MB-TXQT_C43496881: 检测颜色:-;接口类型:SPI;分辨率:-;; LCSC Part Name: 2件套 光学运动跟踪芯片; Supplier Part: C43496881; Manufacturer: PixArt (原相科技); Supplier Footprint: COB-28; JLCPCB Part Class: Extended Part; Datasheet: https://item.szlcsc.com/datasheet/PMW3901MB-TXQT/45590711.html; Supplier: LCSC; Photoperceptivity: 110lx; Interface: SPI; Voltage - Supply: 1.8V~2.1V; Operating Temperature: 0℃~+40℃; Length: 6mm; Width: 6mm; Height: 2.28mm; Features: 低功耗/睡眠模式；中断/事件触发
U4 = VL53L1CXV0FY/1: 类型:-;接口类型:I2C;旋转角度范围:-;线性范围:4m;; LCSC Part Name: 新一代长距离飞行时间测距传感器; Supplier Part: C190004; Manufacturer: ST(意法半导体); Supplier Footprint: LGA-12(2.5x4.9); JLCPCB Part Class: Extended Part; Datasheet: https://item.szlcsc.com/datasheet/VL53L1CXV0FY%252F1/207718.html; Supplier: LCSC; Interface: I2C; Voltage - Supply: 2.6V~3.5V; Linear Range: 4m; Current - Supply: 16mA; Module: 是; Length: 4.9mm; Width: 2.5mm; Height: 1.56mm; Operating Temperature: -20℃~+85℃; Features: 可编程传输
FPC1-FPC4 = 1.25-2PWB: 插针结构:1x2P;间距:1.25mm;安装方式:卧贴;参考系列:PicoBlade(MX 1.25);总PIN数:2P;排数:1;每排PIN数:2;行距:-;额定电流:1A;触头材质:黄铜;触头镀层:锡;工作温度:-25℃~+85℃;; LCSC Part Name: 1x2P 间距:1.25mm 卧贴 系列:PicoBlade(MX 1.25); Supplier Part: C2905009; Manufacturer: DEALON(德艺隆); Supplier Footprint: SMD,P=1.25mm,卧贴; JLCPCB Part Class: Extended Part; Datasheet: https://item.szlcsc.com/datasheet/1.25-2PWB/3172294.html; Supplier: LCSC; Pins Structure: 1x2P; Pitch: 1.25mm; Mounting Type: 卧贴; Reference Series: PicoBlade(MX 1.25); Number of Pins: 2P; Number of Rows: 1; Number of PINs Per Row: 2; Current Rating: 1A; Contact Material: 黄铜; Contact Plating: 锡; Operating Temperature: -25℃~+85℃; Voltage Rating: 125V; Plastic Material: LCP; Flame Retardant Rating: UL94V-0; Supplementary Features: 辅助焊脚; Color: 米色
Q2-Q5 = AO3400A_C347475: 数量:1个N沟道;漏源电压(Vdss):30V;连续漏极电流(Id):5.8A;导通电阻(RDS(on)):17mΩ@10V;耗散功率(Pd):1.4W;阈值电压(Vgs(th)):1.1V;; LCSC Part Name: 1个N沟道 耐压:30V 电流:5.8A; Supplier Part: C347475; Manufacturer: UMW(友台半导体); Supplier Footprint: SOT-23; JLCPCB Part Class: Extended Part; Datasheet: https://item.szlcsc.com/datasheet/AO3400A/324135.html; Supplier: LCSC; Number: 1个N沟道; Drain to Source Voltage: 30V; Current - Continuous Drain(Id): 5.8A; RDS(on): 17mΩ@10V; Pd - Power Dissipation: 1.4W; Gate Threshold Voltage (Vgs(th)): 1.1V; Gate Charge(Qg): 9.7nC@4.5V; Input Capacitance(Ciss): 823pF; Reverse Transfer Capacitance (Crss@Vds): 77pF; Operating Temperature: -55℃~+150℃; Output Capacitance(Coss): 99pF
CN2 = ZX-XH2.54-2PWT: 插针结构:1x2P;间距:2.5mm;安装方式:卧贴;参考系列:XH;总PIN数:2P;排数:1;每排PIN数:2;行距:-;额定电流:3A;触头材质:黄铜;触头镀层:锡;工作温度:-25℃~+85℃;; LCSC Part Name: 1x2P 间距:2.5mm 卧贴 系列:XH; Supplier Part: C7429671; Manufacturer: Megastar(兆星); Supplier Footprint: SMD,P=2.5mm,卧贴; JLCPCB Part Class: Extended Part; Datasheet: https://item.szlcsc.com/datasheet/ZX-XH2.54-2PWT/8427588.html; Supplier: LCSC; Pins Structure: 1x2P; Pitch: 2.5mm; Mounting Type: 卧贴; Reference Series: XH; Number of Pins: 2P; Number of Rows: 1; Number of PINs Per Row: 2; Current Rating: 3A; Contact Material: 黄铜; Contact Plating: 锡; Operating Temperature: -25℃~+85℃; Voltage Rating: 250V; Plastic Material: LCP; Supplementary Features: 辅助焊脚; Color: 米色; Z-Height of the Board: 6.2mm; X-Length of Bottom Edge on Board (Spacing Line): 10mm; Y-Width of Bottom Edge on Board: 7.8mm
L5 = FTC252012S2R2MBCA: 电感值:2.2uH;精度:±20%;额定电流:3A;饱和电流(Isat):3.8A;类型:-;; LCSC Part Name: 2.2uH ±20% 3.8A; Supplier Part: C5832372; Manufacturer: cjiang(长江微电); Supplier Footprint: 1008; JLCPCB Part Class: Extended Part; Datasheet: https://item.szlcsc.com/datasheet/FTC252012S2R2MBCA/6763492.html; Supplier: LCSC; Tolerance: ±20%; Current Rating: 3A; Current - Saturation(Isat): 3.8A; DC Resistance(DCR): 55mΩ
Q1 = AMS1117-3.3V_C5120796: 输出极性:正极;工作电压:15V;输出电压:3.3V;输出电流:1A;电源纹波抑制比(PSRR):-;输出类型:固定;; LCSC Part Name: 3.3V 1A 15V; Supplier Part: C5120796; Manufacturer: MSKSEMI(美森科); Supplier Footprint: SOT-89; JLCPCB Part Class: Extended Part; Datasheet: https://item.szlcsc.com/datasheet/AMS1117-3.3V/5706251.html; Supplier: LCSC; Output Configuration: 正极; Voltage - Supply: 15V; Output Voltage: 3.3V; Output Current: 1A; standby current: 12mA; Operating Temperature: 0℃~+125℃@(Ta); Output Type: 固定; Number of Outputs: 1
U6 = IP5305T: 工作电压:4.65V~5.5V;最大充电电流:1.4A;电池类型:锂电池;电池节数:1;; LCSC Part Name: 1.2A充电 1.0A放电高集成度移动电源SOC; Supplier Part: C2982924; Manufacturer: INJOINIC(英集芯); Supplier Footprint: ESOP-8; JLCPCB Part Class: Extended Part; Datasheet: https://item.szlcsc.com/datasheet/IP5305T/3415531.html; Supplier: LCSC; The Chip Type: 充电芯片; Voltage - Supply: 4.65V~5.5V; Charge Current - Max: 1.4A; Charging Saturation Voltage: 4.2V; End-Off Voltage: 2.85V; Type of Battery: 锂电池; Number of Cells: 1; Operating Temperature: -20℃~+70℃; Battery Temperature Detection: 不支持; Supply Current (Iq): 100uA
U7 = XC6204B182MR: 输出极性:正极;工作电压:24V;输出电压:1.8V;输出电流:300mA;电源纹波抑制比(PSRR):70dB@(1kHz);输出类型:固定;; LCSC Part Name: 1.8V 300mA 24V; Supplier Part: C18212674; Manufacturer: TECH PUBLIC(台舟); Supplier Footprint: SOT-23-5; JLCPCB Part Class: Extended Part; Datasheet: https://item.szlcsc.com/datasheet/XC6204B182MR/19384462.html; Supplier: LCSC; Output Configuration: 正极; Voltage - Supply: 24V; Output Voltage: 1.8V; Output Current: 300mA; Power Supply Rejection Ratio (PSRR): 70dB@(1kHz); Voltage Dropout: 500mV@(100mA); standby current: 2uA; Features: 过流保护；使能控制；热关断; Operating Temperature: -40℃~+125℃@(Tj); Output Type: 固定; Number of Outputs: 1

## Nets
1V8: C34.2 R14.1 U7.5(VOUT)
3V3: C4.2 C5.2 C6.2 C7.2 C9.1 C10.1 C12.1 C13.2 C14.2 C22.2 C23.2 C24.2 C27.2 C32.1 C36.1 C37.2 C40.2 C41.2 Q1.2(VOUT) R1.2 R4.2 R5.2 R9.1 R10.1 R11.1 R12.1 R13.1 R26.2 R27.2 R28.2 R29.2 R34.1 U1.9(VDDA) U1.24(VDD_1) U1.36(VDD_2) U1.48(VDD_3) U2.8(VLOGIC) U2.13(VDD) U3.7(VCC) U3.15(VCC) U3.18(VCC) U4.1(AVDDVCSEL) U4.11(AVDD) U5.3(VDDIO) U7.1(VIN)
+5V: C30.1 C38.2 Q1.3(VIN) U6.8(VOUT)
GND: C1.1 C2.1 C3.2 C4.1 C5.1 C6.1 C7.1 C8.2 C9.2 C10.2 C11.1 C12.2 C13.1 C14.1 C16.1 C17.1 C18.1 C19.2 C20.2 C21.1 C22.1 C23.1 C24.1 C25.1 C26.1 C27.1 C28.2 C29.1 C30.2 C31.2 C32.2 C33.2 C34.1 C35.2 C36.2 C37.1 C38.1 C39.1 C40.1 C41.1 CN1.1 CN2.2 CN2.3 CN2.4 FPC1.3 FPC1.4 FPC2.3 FPC2.4 FPC3.3 FPC3.4 FPC4.3 FPC4.4 Q1.1(ADJ/GND) Q2.2(S) Q3.2(S) Q4.2(S) Q5.2(S) R2.2 R6.1 R7.2 R15.1 R16.1 R19.1 R21.1 R23.1 R25.1 R31.1 SW1.3 SW1.4 SW3.3 SW3.4 U1.8(VSSA) U1.23(VSS_1) U1.35(VSS_2) U1.47(VSS_3) U2.1(CLKIN) U2.11(FSYNC) U2.18(GND) U2.25(EP) U3.8(VSS) U3.14(VSS) U3.17(VSS) U3.20(VSS) U3.21(EP) U4.2(AVSSVCSEL) U4.3(GND) U4.4(GND2) U4.6(GND3) U4.12(GND4) U5.1(GND) U5.21(GND) U5.29(GND) U6.9(EP) U7.2(VSS) X1.2 X1.4 X2.2(GND) X2.4(GND)
VBAT: C31.1 CN2.1 FPC1.2 FPC2.2 FPC3.2 FPC4.2 L5.2 Q6.2(S) R33.1 U6.6(BAT)
VCC: C29.2 CN1.2 R3.1 U6.1(VIN)
AT1: C15.2 C16.2
BAT-ADC-EN: R32.2 R33.2 U1.41(PB5)
BAT_DET: R30.1 R31.2 U1.19(PB1)
I2C1-SCL: R4.1 U1.42(PB6) U2.23(SCL)
I2C1-SDA: R5.1 U1.43(PB7) U2.24(SDA)
I2C2-SCL: R10.2 U1.21(PB10) U4.10(SCL)
I2C2-SDA: R11.2 U1.22(PB11) U4.9(SDA)
LED1: LED1.2(K) U1.33(PA12)
LED2: LED2.2(K) U1.32(PA11)
LED3: LED3.2(K) U1.18(PB0)
LED4: LED4.2(K) U1.10(PA0-WKUP)
LEFT-0: R18.1 U1.40(PB4)
LEFT-1: R20.1 U1.46(PB9)
MPU_INT: U1.39(PB3) U2.12(INT)
NRST: C1.2 R1.1 SW1.2 U1.7(NRST)
OSC_IN: C3.1 U1.5(PD0-OSC_IN) X1.1
OSC_OUT: C2.2 U1.6(PD1-OSC_OUT) X1.3
PA1: R22.1 U1.11(PA1)
PA2: CN1.6 U1.12(PA2)
PA3: CN1.5 U1.13(PA3)
PA4: U1.14(PA4) U3.2(CSN)
PA5: U1.15(PA5) U3.3(SCK)
PA6: U1.16(PA6) U3.5(MISO)
PA7: U1.17(PA7) U3.4(MOSI)
PA8: U1.29(PA8) U3.1(CE)
PA9: U1.30(PA9) U3.6(IRQ)
PA10: R24.1 U1.31(PA10)
PA13: CN1.4 U1.34(PA13)
PA14: CN1.3 U1.37(PA14)
PA15: U1.38(PA15) U5.15(MOTION)
PB2: R17.2 SW3.1 U1.20(PB2)
PB8: R34.2 U1.45(PB8) U5.7(NRESET)
PB12: U1.25(PB12) U5.19(NCS)
PB13: U1.26(PB13) U5.17(SCLK)
PB14: U1.27(PB14) U5.18(MISO)
PB15: U1.28(PB15) U5.16(MOSI)
PC14: R9.2 U1.3(PC14-OSC32_IN) U4.5(XSHUT)
PC15: R12.2 U1.4(PC15-OSC32_OUT) U4.7(GPIO1)
XI: C20.1 R8.1 U3.10(XI) X2.1(OSC1)
XO: C21.2 R8.2 U3.9(XO) X2.3(OSC2)
$1N28: R2.1 U1.44(BOOT0)
$1N68: LED4.1(A) R26.1
$1N70: LED1.1(A) R29.1
$1N71: LED2.1(A) R28.1
$1N72: LED3.1(A) R27.1
$1N90: Q6.3(D) R30.2
$1N91: Q6.1(G) R32.1
$2N9: C8.1 U2.20(CPOUT)
$2N13: C11.2 U2.10(REGOUT)
$2N14: R6.2 U2.9(AD0)
$3N27: L1.1 L2.2 U3.13(RFN)
$3N28: C15.1 L1.2
$3N29: L2.1 L3.2 U3.12(RFP)
$3N30: C17.2 C18.2 L3.1 U3.11(VDD_PA)
$3N35: R7.1 U3.16(IREF)
$3N37: C19.1 U3.19(VDD_D)
$5N18: LED7.1(A) LED8.2(K) R16.2 U6.3(LED2)
$5N19: LED5.1(A) LED6.2(K) R15.2 U6.2(LED1)
$5N20: LED5.2(K) LED6.1(A) LED7.2(K) LED8.1(A) U6.4(LED3)
$5N26: L5.1 U6.7(SW)
$5N28: R17.1 U6.5(KEY)
$5N39: R13.2 U7.3(CE)
$5N42: C39.2 R3.2
$6N2: FPC1.1 Q2.3(D)
$6N6: Q2.1(G) R18.2 R19.2
$6N9: Q3.1(G) R20.2 R21.2
$6N11: FPC2.1 Q3.3(D)
$6N14: Q4.1(G) R22.2 R23.2
$6N16: FPC3.1 Q4.3(D)
$6N19: Q5.1(G) R24.2 R25.2
$6N21: FPC4.1 Q5.3(D)
$7N7: C25.2 C26.2 U5.4(VREG)
$7N9: C28.1 C33.1 C35.1 R14.2 U5.2(VDD)

Not connected (* = marked no-connect by the designer): SW1 1*; SW3 2*; U1 1(VBAT)* 2(PC13-TAMPER-RTC)*; U2 2(NC)* 3(NC)* 4(NC)* 5(NC)* 6(AUX_DA)* 7(AUX_CL)* 14(NC)* 15(NC)* 16(NC)* 17(NC)* 19(RESV)* 21(RESV)* 22(RESV)*; U4 8(DNC)*; U5 5(NC)* 6(NC)* 8(NC)* 9(NC)* 10(NC)* 11(NC)* 12(NC)* 13(NC)* 14(NC)* 20(NC)* 22(NC)* 23(NC)* 24(NC)* 25(NC)* 26(NC)* 27(NC)* 28(NC)*; U7 4(NC)*

## Notes on the sheets
sheet 1
- BAT_DET=VBAT*R2/(R1+R2)
